# EAGLE board control (EAGLE 8.1.1), part 1 of 2
VERSION: v2.1
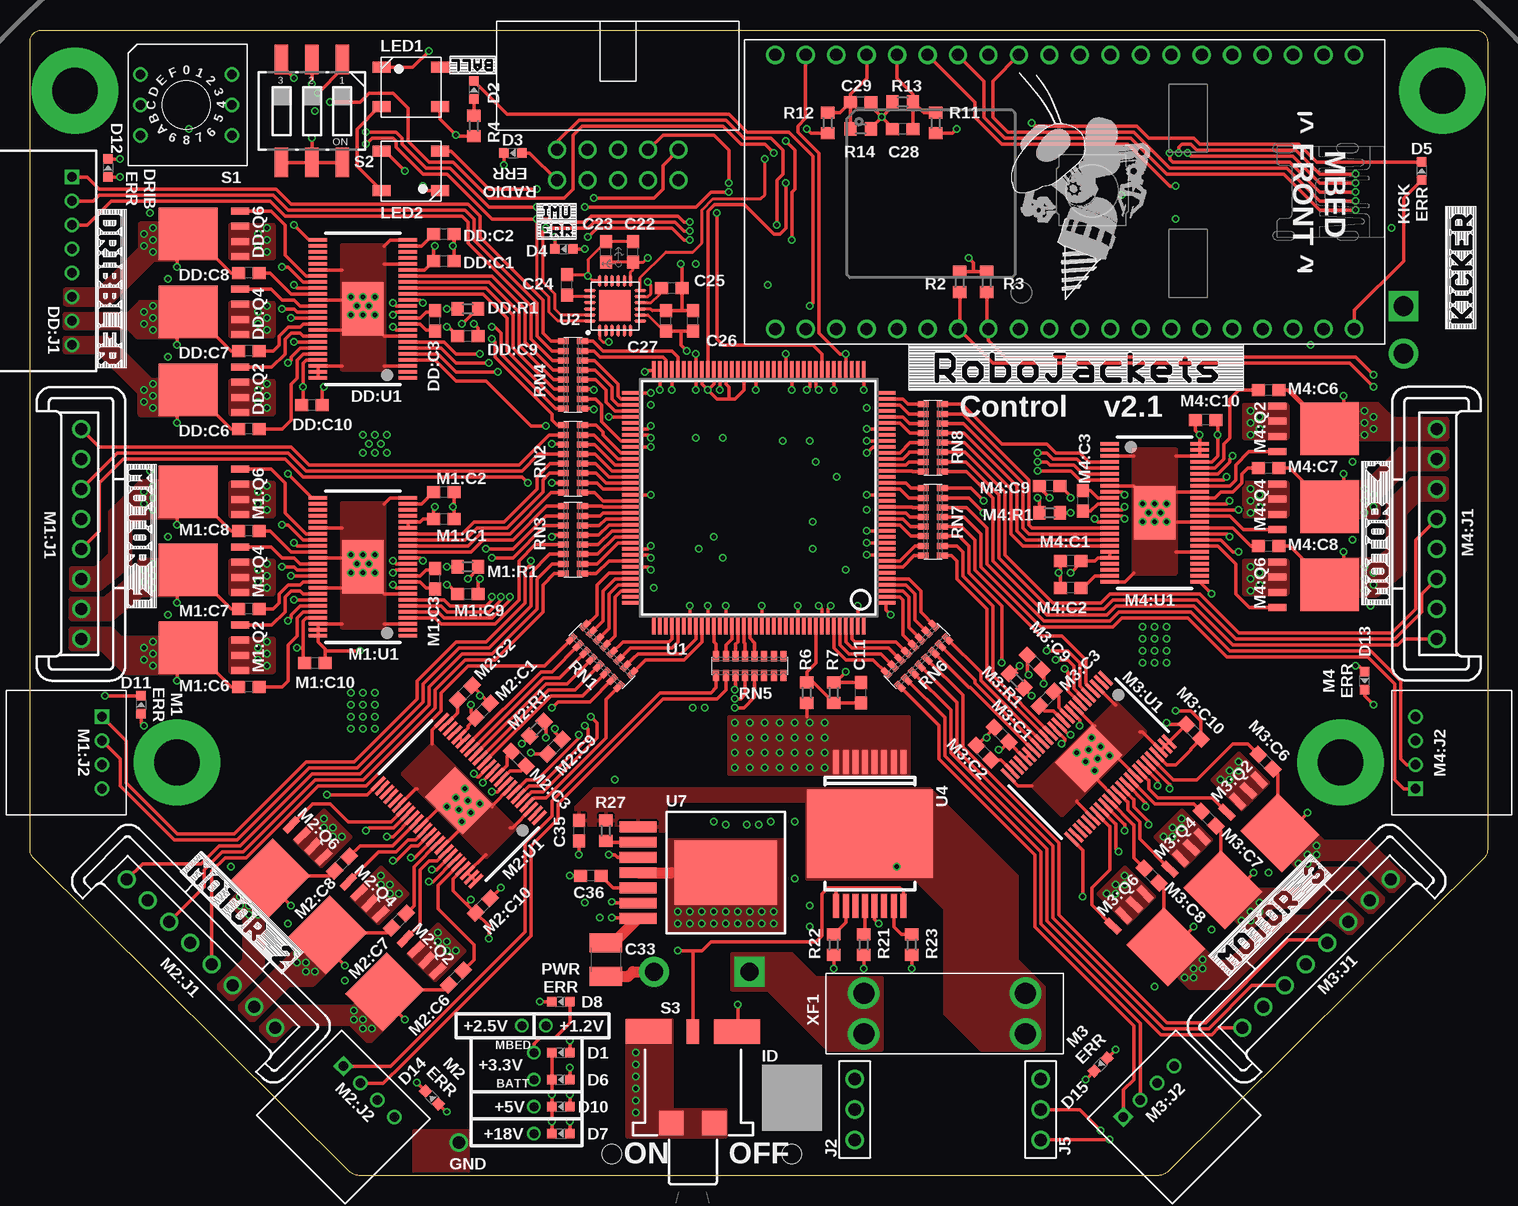
[diagram p7: board, top side]
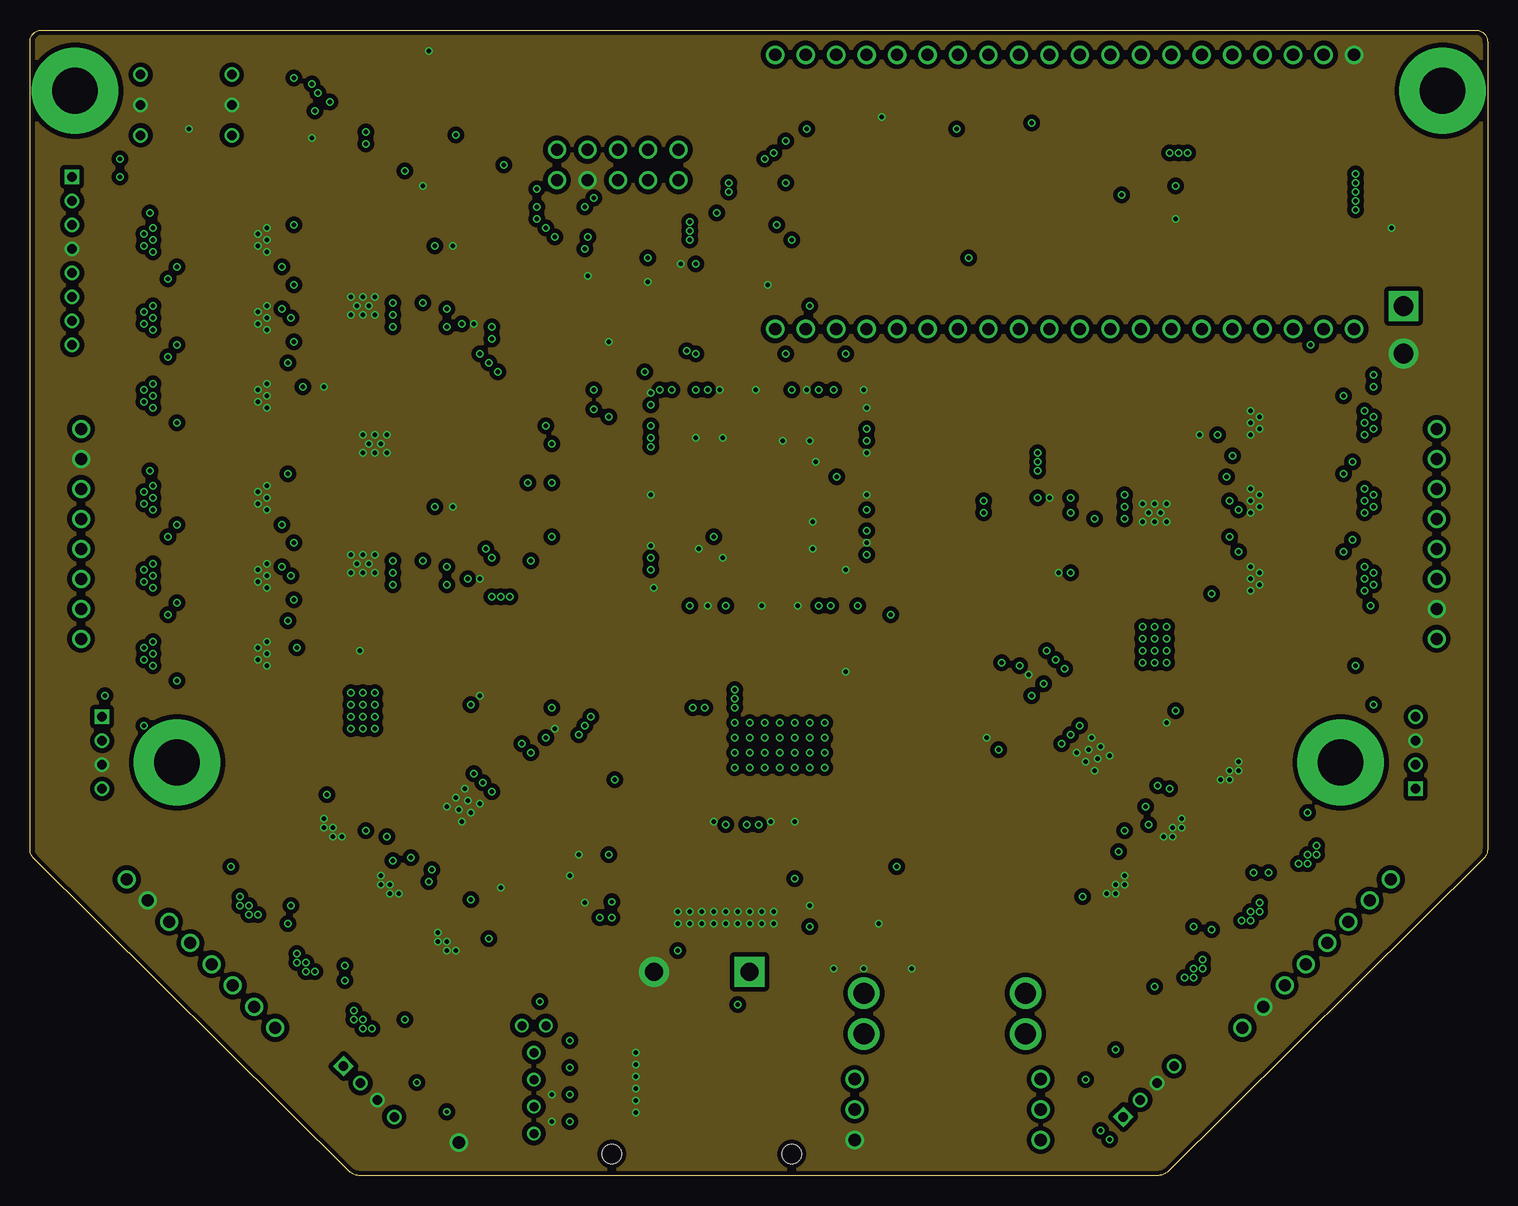
[diagram p8: board, inner layer GND]
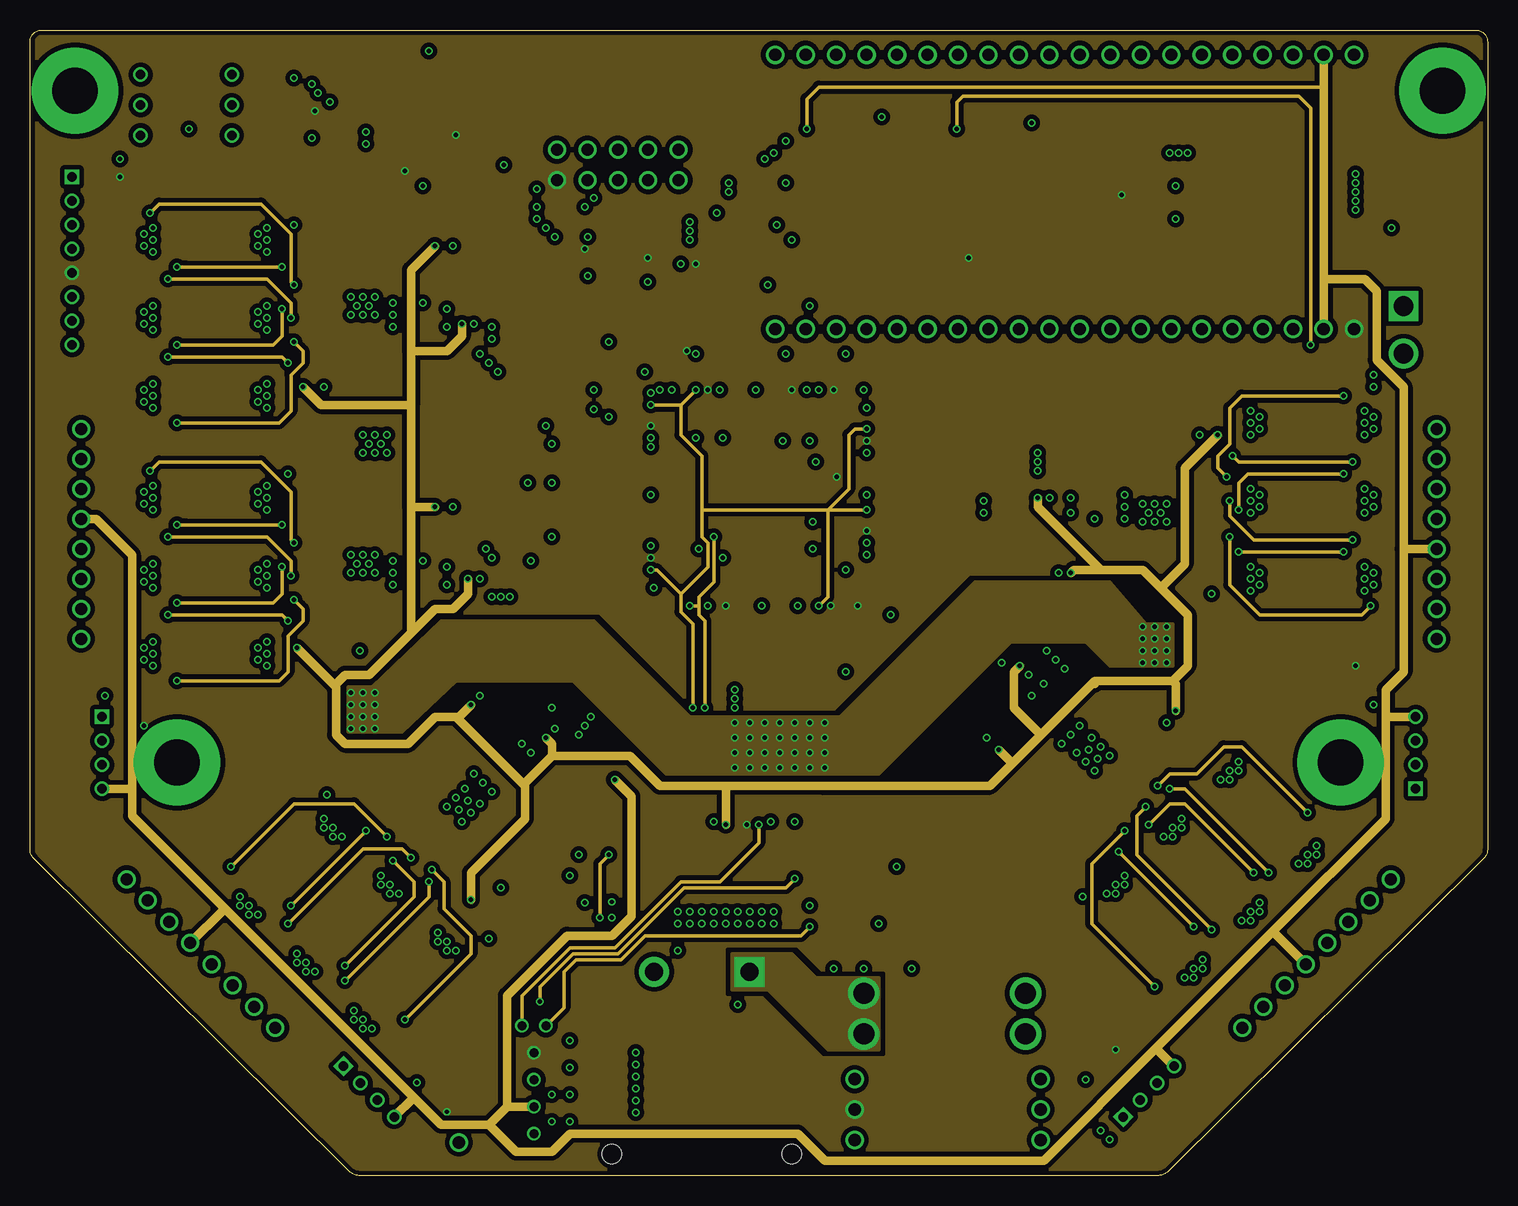
[diagram p9: board, inner layer Power]
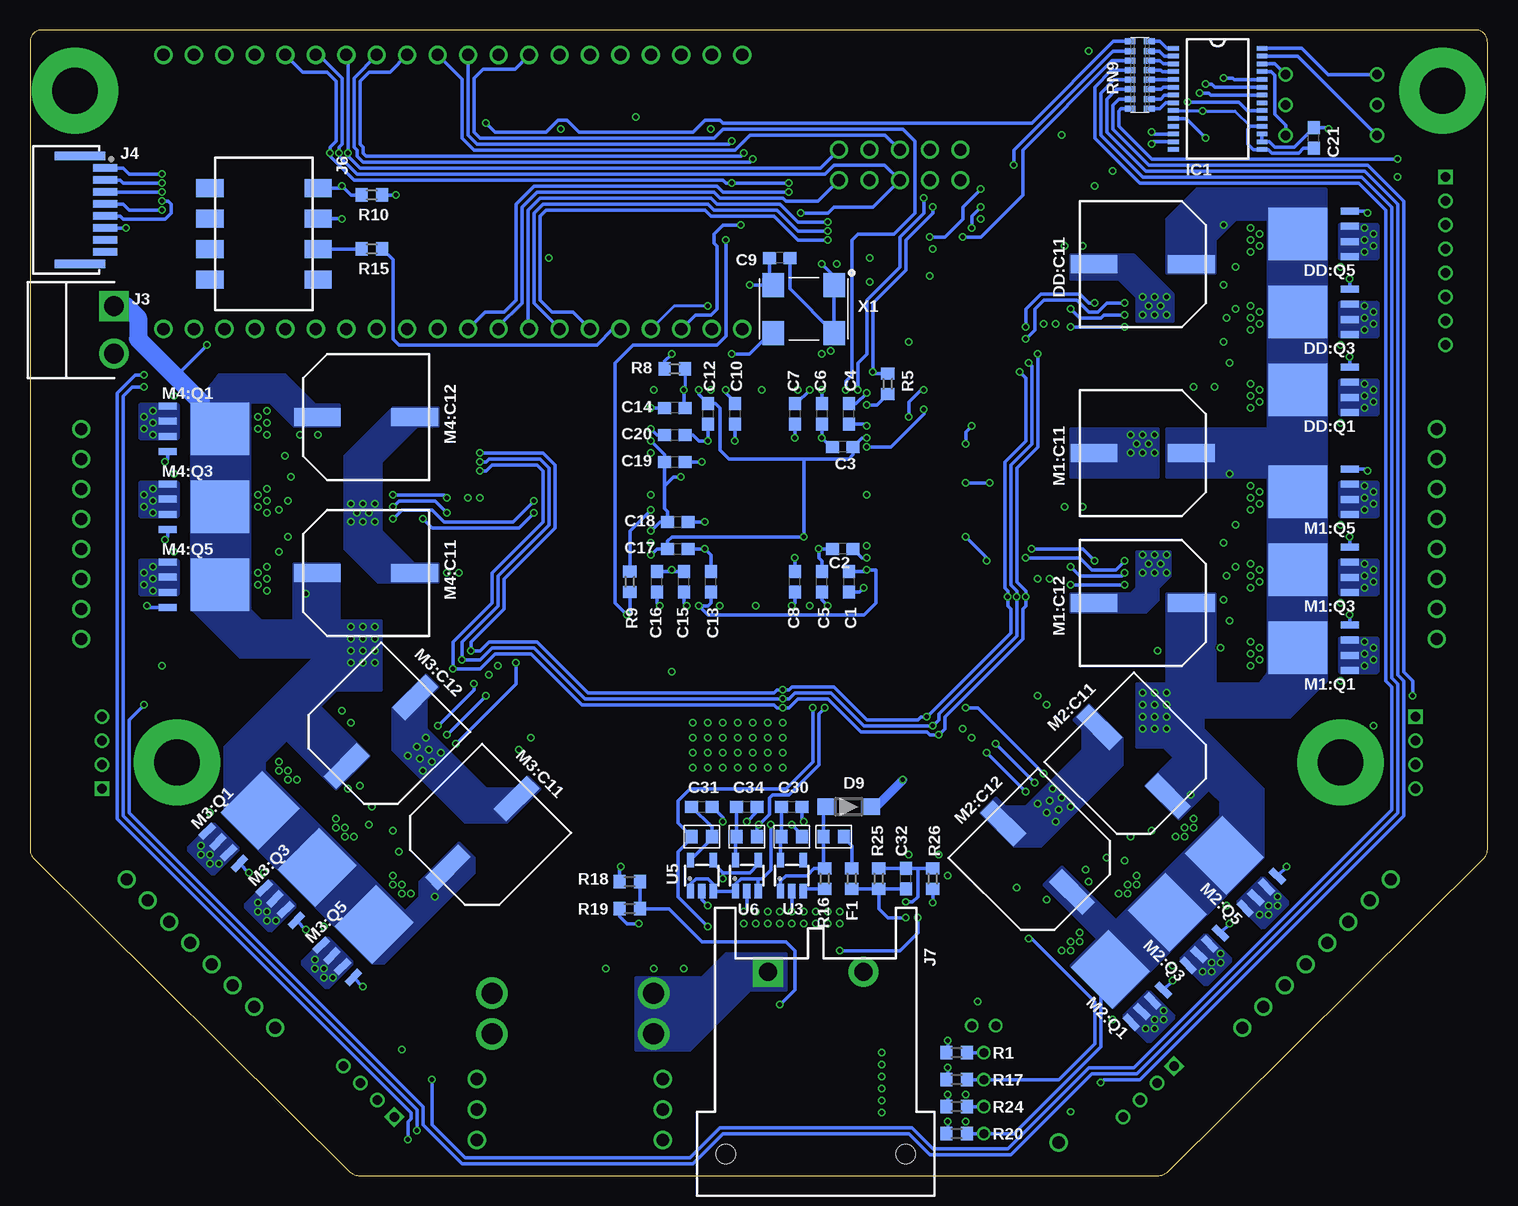
[diagram p10: board, bottom side, seen from below]

Size 121.5 x 95.5 mm. Coordinates in mm from the lower left corner, seen from the top.
Outline: 121.2,26.46 94.79,0.29 arc-45 94.09,0 27.41,0 arc-45 26.71,0.29 0.3,26.46 arc-45 0,27.17 0,94.5 arc-90 1,95.5 120.5,95.5 arc-90 121.5,94.5 121.5,27.17 arc-45 121.2,26.46
Copper layers (1+2*3+16): Top 0.018mm / dielectric 0.36mm / GND 0.035mm / dielectric 0.71mm / Power 0.035mm / dielectric 0.36mm / Bottom 0.018mm
Design rules "eC_4Layer_PClass6_BaseCopperO18-I35_eCDefault *": minimum track width 0.15mm, minimum drill 0.35mm, track to track 0.15mm, track to pad 0.15mm, pad to pad 0.15mm, via to via 0.15mm, smd to smd 0mil, copper to edge 0.25mm, drill to drill 0.35mm, minimum pad ring 0.175mm, minimum via ring 0.125mm, stop-mask expansion 0mil, vias tented up to drill 0.45mm, thermal gap 0.2mm

## Footprints (pad centres in the part's own frame; a part is rotated, then mirrored left to right if it is on the bottom)
C0603 = smd 1.1 x 1: 1 -0.85,0; 2 0.85,0
C1210 = smd 1.6 x 2.7: 1 -1.4,0; 2 1.4,0
CHIP-LED0603 = smd 0.8 x 0.8: A 0,-0.75; C 0,0.75
SOD123 = smd 1.4 x 1.4: A 1.9,0; C -1.9,0
UWZ1H221MCL1GS = smd 1.5 x 3.9: 1 0,4.05; 2 0,-4.05
2MM-8-H = drill 0.8 square: 1 -7,0 | drill 0.8: 2 -5,0; 3 -3,0; 4 -1,0; 5 1,0; 6 3,0; 7 5,0; 8 7,0
PQFN_5X6_E = smd 1.5 x 0.6: 1 -3.02,1.905; 2 -3.02,0.635; 3 -3.02,-0.635; 4 -3.02,-1.905 | smd 4.895 x 4.41: 5678 1.323,0
R0603 = smd 1 x 1.1: 1 -0.85,0; 2 0.85,0
TSSOP-48_PAD = smd 0.3 x 1.55: 1 -5.75,-3.75; 2 -5.25,-3.75; 3 -4.75,-3.75; 4 -4.25,-3.75; 5 -3.75,-3.75; 6 -3.25,-3.75; 7 -2.75,-3.75; 8 -2.25,-3.75; 9 -1.75,-3.75; 10 -1.25,-3.75; 11 -0.75,-3.75; 12 -0.25,-3.75; 13 0.25,-3.75; 14 0.75,-3.75; 15 1.25,-3.75; 16 1.75,-3.75; 17 2.25,-3.75; 18 2.75,-3.75; 19 3.25,-3.75; 20 3.75,-3.75; 21 4.25,-3.75; 22 4.75,-3.75; 23 5.25,-3.75; 24 5.75,-3.75; 25 5.75,3.75; 26 5.25,3.75; 27 4.75,3.75; 28 4.25,3.75; 29 3.75,3.75; 30 3.25,3.75; 31 2.75,3.75; 32 2.25,3.75; 33 1.75,3.75; 34 1.25,3.75; 35 0.75,3.75; 36 0.25,3.75; 37 -0.25,3.75; 38 -0.75,3.75; 39 -1.25,3.75; 40 -1.75,3.75; 41 -2.25,3.75; 42 -2.75,3.75; 43 -3.25,3.75; 44 -3.75,3.75; 45 -4.25,3.75; 46 -4.75,3.75; 47 -5.25,3.75; 48 -5.75,3.75 | smd 4.42 x 3.483: PAD 0,0
F0603 = smd 1 x 1.1: 1 -0.85,0; 2 0.85,0
SSOP-28 = smd 0.9 x 0.38: 1 -3.7,4.225; 2 -3.7,3.575; 3 -3.7,2.925; 4 -3.7,2.275; 5 -3.7,1.625; 6 -3.7,0.975; 7 -3.7,0.325; 8 -3.7,-0.325; 9 -3.7,-0.975; 10 -3.7,-1.625; 11 -3.7,-2.275; 12 -3.7,-2.925; 13 -3.7,-3.575; 14 -3.7,-4.225; 15 3.7,-4.225; 16 3.7,-3.575; 17 3.7,-2.925; 18 3.7,-2.275; 19 3.7,-1.625; 20 3.7,-0.975; 21 3.7,-0.325; 22 3.7,0.325; 23 3.7,0.975; 24 3.7,1.625; 25 3.7,2.275; 26 3.7,2.925; 27 3.7,3.575; 28 3.7,4.225
SBH11-*-D05-RA = drill 1: 1 -5.08,-1.27; 2 -2.54,-1.27; 3 0,-1.27; 4 2.54,-1.27; 5 5.08,-1.27; 6 5.08,1.27; 7 2.54,1.27; 8 0,1.27; 9 -2.54,1.27; 10 -5.08,1.27
3-PIN-HEADER = drill 1.02: 1 -2.54,0; 2 0,0; 3 2.54,0
B2PS-CENTERED = drill 1.65 square: 1 -1.98,0 | drill 1.65: 2 1.98,0
HFW8R-1ST = smd 0.6 x 2: 1 -3.5,3.25; 2 -2.5,3.25; 3 -1.5,3.25; 4 -0.5,3.25; 5 0.5,3.25; 6 1.5,3.25; 7 2.5,3.25; 8 3.5,3.25 | smd 0.7 x 4.2: LEG1 -4.5,1.15; LEG2 4.5,1.15
147721-3 = smd 1.52 x 2.29: 1 -3.81,4.52; 2 -1.27,4.52; 3 1.27,4.52; 4 3.81,4.52; 5 3.81,-4.52; 6 1.27,-4.52; 7 -1.27,-4.52; 8 -3.81,-4.52
DF22-2-H = drill 1.5 pad 2.5 square: 1 3.96,0 | drill 1.5 pad 2.5: 2 -3.96,0 | hole 1.6: -7.5,15.2; 7.5,15.2
MBED-KIT = drill 1.02: D+ 11.43,1.27; D- 11.43,3.81; GND -11.43,24.13; IF+ 11.43,16.51; IF- 11.43,19.05; NR -11.43,16.51; P$5 -11.43,13.97; P$6 -11.43,11.43; P$7 -11.43,8.89; P$8 -11.43,6.35; P$9 -11.43,3.81; P$10 -11.43,1.27; P$11 -11.43,-1.27; P$12 -11.43,-3.81; P$13 -11.43,-6.35; P$14 -11.43,-8.89; P$15 -11.43,-11.43; P$16 -11.43,-13.97; P$17 -11.43,-16.51; P$18 -11.43,-19.05; P$19 -11.43,-21.59; P$20 -11.43,-24.13; P$21 11.43,-24.13; P$22 11.43,-21.59; P$23 11.43,-19.05; P$24 11.43,-16.51; P$25 11.43,-13.97; P$26 11.43,-11.43; P$27 11.43,-8.89; P$28 11.43,-6.35; P$29 11.43,-3.81; P$30 11.43,-1.27; RD+ 11.43,11.43; RD- 11.43,13.97; TD+ 11.43,6.35; TD- 11.43,8.89; VB -11.43,19.05; VIN -11.43,21.59; VOUT 11.43,24.13; VU 11.43,21.59
5050 = smd 1.5 x 0.9: 1 -2.45,1.65; 2 -2.45,-1.65; 3 2.45,-1.65; 4 2.45,1.65
MKS-1658 = drill 1 pad 1.422: 1 -8.75,0; 2 -6.25,0; 3 -3.75,0; 4 -1.25,0; 5 1.25,0; 6 3.75,0; 7 6.25,0; 8 8.75,0
2MM-4-H = drill 0.8 square: 1 -3,0 | drill 0.8: 2 -1,0; 3 1,0; 4 3,0
RA-8_2506 = smd 0.5 x 0.9: 1 -2.8,-0.8; 2 -2,-0.8; 3 -1.2,-0.8; 4 -0.4,-0.8; 5 0.4,-0.8; 6 1.2,-0.8; 7 2,-0.8; 8 2.8,-0.8; 9 2.8,0.8; 10 2,0.8; 11 1.2,0.8; 12 0.4,0.8; 13 -0.4,0.8; 14 -1.2,0.8; 15 -2,0.8; 16 -2.8,0.8
HEX = drill 0.8: 1 -2.54,-2.54; 2 2.54,5.08; 4 2.54,-2.54; 8 -2.54,5.08; C1 0,-2.54; C2 0,5.08
CTS-219-03 = smd 1.13 x 2.44: 1 -2.54,-4.3; 2 0,-4.3; 3 2.54,-4.3; 4 2.54,4.3; 5 0,4.3; 6 -2.54,4.3
34EWMSP12M6RT = smd 3.81 x 2.03: 1 -3.685,0; 3 3.685,0 | smd 1.02 x 2.03: 2 0,0 | smd 2.03 x 2.03: LEG1 -1.78,7.62; LEG3 1.78,7.62
SB0603 = smd 1 x 1.1: 1 -0.85,0; 2 0.85,0
TQFP144 = smd 0.3 x 1.6: 1 -8.75,-10.6; 2 -8.25,-10.6; 3 -7.75,-10.6; 4 -7.25,-10.6; 5 -6.75,-10.6; 6 -6.25,-10.6; 7 -5.75,-10.6; 8 -5.25,-10.6; 9 -4.75,-10.6; 10 -4.25,-10.6; 11 -3.75,-10.6; 12 -3.25,-10.6; 13 -2.75,-10.6; 14 -2.25,-10.6; 15 -1.75,-10.6; 16 -1.25,-10.6; 17 -0.75,-10.6; 18 -0.25,-10.6; 19 0.25,-10.6; 20 0.75,-10.6; 21 1.25,-10.6; 22 1.75,-10.6; 23 2.25,-10.6; 24 2.75,-10.6; 25 3.25,-10.6; 26 3.75,-10.6; 27 4.25,-10.6; 28 4.75,-10.6; 29 5.25,-10.6; 30 5.75,-10.6; 31 6.25,-10.6; 32 6.75,-10.6; 33 7.25,-10.6; 34 7.75,-10.6; 35 8.25,-10.6; 36 8.75,-10.6; 73 8.75,10.6; 74 8.25,10.6; 75 7.75,10.6; 76 7.25,10.6; 77 6.75,10.6; 78 6.25,10.6; 79 5.75,10.6; 80 5.25,10.6; 81 4.75,10.6; 82 4.25,10.6; 83 3.75,10.6; 84 3.25,10.6; 85 2.75,10.6; 86 2.25,10.6; 87 1.75,10.6; 88 1.25,10.6; 89 0.75,10.6; 90 0.25,10.6; 91 -0.25,10.6; 92 -0.75,10.6; 93 -1.25,10.6; 94 -1.75,10.6; 95 -2.25,10.6; 96 -2.75,10.6; 97 -3.25,10.6; 98 -3.75,10.6; 99 -4.25,10.6; 100 -4.75,10.6; 101 -5.25,10.6; 102 -5.75,10.6; 103 -6.25,10.6; 104 -6.75,10.6; 105 -7.25,10.6; 106 -7.75,10.6; 107 -8.25,10.6; 108 -8.75,10.6 | smd 1.6 x 0.3: 37 10.6,-8.75; 38 10.6,-8.25; 39 10.6,-7.75; 40 10.6,-7.25; 41 10.6,-6.75; 42 10.6,-6.25; 43 10.6,-5.75; 44 10.6,-5.25; 45 10.6,-4.75; 46 10.6,-4.25; 47 10.6,-3.75; 48 10.6,-3.25; 49 10.6,-2.75; 50 10.6,-2.25; 51 10.6,-1.75; 52 10.6,-1.25; 53 10.6,-0.75; 54 10.6,-0.25; 55 10.6,0.25; 56 10.6,0.75; 57 10.6,1.25; 58 10.6,1.75; 59 10.6,2.25; 60 10.6,2.75; 61 10.6,3.25; 62 10.6,3.75; 63 10.6,4.25; 64 10.6,4.75; 65 10.6,5.25; 66 10.6,5.75; 67 10.6,6.25; 68 10.6,6.75; 69 10.6,7.25; 70 10.6,7.75; 71 10.6,8.25; 72 10.6,8.75; 109 -10.6,8.75; 110 -10.6,8.25; 111 -10.6,7.75; 112 -10.6,7.25; 113 -10.6,6.75; 114 -10.6,6.25; 115 -10.6,5.75; 116 -10.6,5.25; 117 -10.6,4.75; 118 -10.6,4.25; 119 -10.6,3.75; 120 -10.6,3.25; 121 -10.6,2.75; 122 -10.6,2.25; 123 -10.6,1.75; 124 -10.6,1.25; 125 -10.6,0.75; 126 -10.6,0.25; 127 -10.6,-0.25; 128 -10.6,-0.75; 129 -10.6,-1.25; 130 -10.6,-1.75; 131 -10.6,-2.25; 132 -10.6,-2.75; 133 -10.6,-3.25; 134 -10.6,-3.75; 135 -10.6,-4.25; 136 -10.6,-4.75; 137 -10.6,-5.25; 138 -10.6,-5.75; 139 -10.6,-6.25; 140 -10.6,-6.75; 141 -10.6,-7.25; 142 -10.6,-7.75; 143 -10.6,-8.25; 144 -10.6,-8.75
QFN-24-4MM2 = smd 1.016 x 0.254: 1 -2.066,1.257; 2 -2.066,0.75; 3 -2.066,0.247; 4 -2.066,-0.287; 5 -2.066,-0.792; 6 -2.066,-1.297; 13 2.086,-1.297; 14 2.086,-0.792; 15 2.086,-0.287; 16 2.086,0.247; 17 2.086,0.75; 18 2.086,1.257 | smd 0.254 x 1.016: 7 -1.267,-2.122; 8 -0.762,-2.122; 9 -0.258,-2.122; 10 0.278,-2.122; 11 0.78,-2.122; 12 1.287,-2.122; 19 1.287,2.082; 20 0.78,2.082; 21 0.278,2.082; 22 -0.258,2.082; 23 -0.762,2.082; 24 -1.267,2.082 | smd 2.616 x 2.616: P$1 0.02,-0.01
SOT-23-5 = smd 0.6 x 1.2: 1 -0.95,-1.306; 2 0,-1.306; 3 0.95,-1.306; 4 0.95,1.306; 5 -0.95,1.306
POWERSO-16 = smd 0.5 x 2: 1 -2.8,-6; 2 -2,-6; 3 -1.2,-6; 4 -0.4,-6; 5 0.4,-6; 6 1.2,-6; 7 2,-6; 8 2.8,-6; 9 2.8,6; 10 2,6; 11 1.2,6; 12 0.4,6; 13 -0.4,6; 14 -1.2,6; 15 -2,6; 16 -2.8,6 | smd 10.5 x 7.4: 17 0,0
TO-PMOD-7 = smd 0.89 x 3.06: 1 -3.81,-7.305; 2 -2.54,-7.305; 3 -1.27,-7.305; 4 0,-7.305; 5 1.27,-7.305; 6 2.54,-7.305; 7 3.81,-7.305 | smd 5.35 x 8.54: PAD 0,0
ASV = smd 1.8 x 2: 1 -2.54,-2; 2 2.54,-2; 3 2.54,2; 4 -2.54,2
3557-2 = drill 1.75: 1 -6.735,1.7; 2 -6.735,-1.7; 3 6.735,-1.7; 4 6.735,1.7

## Placement (x,y rotation side)
C1  0.1uF  [C0603]  53.25,49.5 270 bottom
C2  0.1uF  [C0603]  53.75,52.25 180 bottom
C3  0.1uF  [C0603]  53.75,60.75 180 bottom
C4  0.1uF  [C0603]  53.25,63.5 90 bottom
C5  0.1uF  [C0603]  55.5,49.5 90 bottom
C6  0.1uF  [C0603]  55.5,63.5 270 bottom
C7  0.1uF  [C0603]  57.75,63.5 270 bottom
C8  0.1uF  [C0603]  57.75,49.5 90 bottom
C9  0.1uF  [C0603]  59,76.5 180 bottom
C10  0.1uF  [C0603]  62.75,63.5 270 bottom
C11  0.1uF  [C0603]  69.25,40.25 90 top
C12  0.1uF  [C0603]  65,63.5 270 bottom
C13  0.1uF  [C0603]  64.75,49.5 90 bottom
C14  0.1uF  [C0603]  67.75,64 180 bottom
C15  0.1uF  [C0603]  67,49.5 90 bottom
C16  0.1uF  [C0603]  69.25,49.5 90 bottom
C17  0.1uF  [C0603]  67.5,52.25 0 bottom
C18  0.1uF  [C0603]  67.5,54.5 0 bottom
C19  0.1uF  [C0603]  67.75,59.5 0 bottom
C20  0.1uF  [C0603]  67.75,61.75 0 bottom
C21  0.1uF  [C0603]  14.5,86.5 90 bottom
C22  0.47uF  [C0603]  50.25,77 90 top
C23  0.47uF  [C0603]  48,77 90 top
C24  2200pF  [C0603]  44.75,74.25 90 top
C25  0.1uF  [C0603]  53.5,74 0 top
C26  10000pF  [C0603]  55.25,71.25 90 top
C27  0.47uF  [C0603]  53,71.25 90 top
C28  0.1uF  [C0603]  72.75,87.25 180 top
C29  0.1uF  [C0603]  69.25,89.5 0 top
C30  1uF  [C0603]  58,30.75 0 bottom
C31  1uF  [C0603]  65.5,30.75 0 bottom
C32  0.022uF  [C0603]  48.5,24.75 90 bottom
C33  LMK325ABJ107MM-P  [C1210]  48,18 270 top
C34  1uF  [C0603]  61.75,30.75 0 bottom
C35  GRM188R6YA106MA73D  [C0603]  45.75,28.75 270 top
C36  0.1uF 50V  [C0603]  46.75,25 180 top
D1  GREEN  [CHIP-LED0603]  44.25,10.25 90 top
D2  BLUE  [CHIP-LED0603]  37,90.5 0 top
D3  RED  [CHIP-LED0603]  40.25,85.25 90 top
D4  RED  [CHIP-LED0603]  44.5,77.25 90 top
D5  RED  [CHIP-LED0603]  116,83.75 0 top
D6  GREEN  [CHIP-LED0603]  44.25,8 90 top
D7  GREEN  [CHIP-LED0603]  44.25,3.5 90 top
D8  RED  [CHIP-LED0603]  44.25,14.5 90 top
D9  [SOD123]  53.25,30.75 180 bottom
D10  GREEN  [CHIP-LED0603]  44.25,5.75 90 top
D11  RED  [CHIP-LED0603]  9.25,39.25 0 top
D12  RED  [CHIP-LED0603]  6.5,84 0 top
D13  RED  [CHIP-LED0603]  111.25,41.25 180 top
D14  RED  [CHIP-LED0603]  33.5,6.5 45 top
D15  RED  [CHIP-LED0603]  89.25,9.25 135 top
DD:C1  1uF  [C0603]  34.5,76.25 0 top
DD:C2  1uF  [C0603]  34.5,78.5 0 top
DD:C3  0.022uF 50V  [C0603]  33.75,71.25 90 top
DD:C6  0.1uF 50V  [C0603]  18.25,62.25 180 top
DD:C7  0.1uF 50V  [C0603]  18.25,68.75 180 top
DD:C8  0.1uF 50V  [C0603]  18.25,75.25 180 top
DD:C9  2.2uF 50V  [C0603]  36.5,70 0 top
DD:C10  0.1uF 50V  [C0603]  23.5,64.25 0 top
DD:C11  UWZ1H221MCL1GS  [UWZ1H221MCL1GS]  28.75,76 270 bottom
DD:J1  8-PIN_2MM-H  [2MM-8-H]  3.5,76.25 270 top
DD:Q1  IRFH7545  [PQFN_5X6_E]  14.5,65.5 180 bottom
DD:Q2  IRFH7545  [PQFN_5X6_E]  14.5,65.5 180 top
DD:Q3  IRFH7545  [PQFN_5X6_E]  14.5,72 180 bottom
DD:Q4  IRFH7545  [PQFN_5X6_E]  14.5,72 180 top
DD:Q5  IRFH7545  [PQFN_5X6_E]  14.5,78.5 180 bottom
DD:Q6  IRFH7545  [PQFN_5X6_E]  14.5,78.5 180 top
DD:R1  10k  [R0603]  36.5,72.25 180 top
DD:U1  DRV8303DCA  [TSSOP-48_PAD]  27.75,72.25 90 top
F1  0603L075SLYR  [F0603]  53,24.75 90 bottom
IC1  MCP23017-E/SS  [SSOP-28]  22.5,89.75 0 bottom
J1  SBH11-PBPC-D05-RA  [SBH11-*-D05-RA]  49,84.25 180 top
J2  3-PIN-HEADER  [3-PIN-HEADER]  68.75,5.5 90 top
J3  B2PS-VH(LF)(SN)  [B2PS-CENTERED]  114.5,70.5 270 bottom
J4  HFW8R-1ST  [HFW8R-1ST]  118.5,80.5 270 bottom
J5  3-PIN-HEADER  [3-PIN-HEADER]  84.25,5.5 90 top
J6  147721-3  [147721-3]  102,78.5 270 bottom
J7  DF22-2  [DF22-2-H]  56,17 180 bottom
KIT1  MBED_NXP_LPC1768  [MBED-KIT]  86.25,82 270 top
LED1  WS2812B  [5050]  31.75,90.75 180 top
LED2  WS2812B  [5050]  31.75,83.75 0 top
M1:C1  1uF  [C0603]  34.5,54.75 0 top
M1:C2  1uF  [C0603]  34.5,57 0 top
M1:C3  0.022uF 50V  [C0603]  33.75,49.75 90 top
M1:C6  0.1uF 50V  [C0603]  18.25,40.75 180 top
M1:C7  0.1uF 50V  [C0603]  18.25,47.25 180 top
M1:C8  0.1uF 50V  [C0603]  18.25,53.75 180 top
M1:C9  2.2uF 50V  [C0603]  36.5,48.5 0 top
M1:C10  0.1uF 50V  [C0603]  23.75,42.75 0 top
M1:C11  UWZ1H221MCL1GS  [UWZ1H221MCL1GS]  28.75,60.25 270 bottom
M1:C12  UWZ1H221MCL1GS  [UWZ1H221MCL1GS]  28.75,47.75 270 bottom
M1:J1  MKS-1658  [MKS-1658]  4.25,53.5 270 top
M1:J2  4-PIN_2MM-H  [2MM-4-H]  6,35.25 270 top
M1:Q1  IRFH7545  [PQFN_5X6_E]  14.5,44 180 bottom
M1:Q2  IRFH7545  [PQFN_5X6_E]  14.5,44 180 top
M1:Q3  IRFH7545  [PQFN_5X6_E]  14.5,50.5 180 bottom
M1:Q4  IRFH7545  [PQFN_5X6_E]  14.5,50.5 180 top
M1:Q5  IRFH7545  [PQFN_5X6_E]  14.5,57 180 bottom
M1:Q6  IRFH7545  [PQFN_5X6_E]  14.5,57 180 top
M1:R1  10k  [R0603]  36.5,50.75 180 top
M1:U1  DRV8303DCA  [TSSOP-48_PAD]  27.75,50.75 90 top
M2:C1  1uF  [C0603]  37.75,38.75 45 top
M2:C2  1uF  [C0603]  36.25,40.25 45 top
M2:C3  0.022uF 50V  [C0603]  40.75,34.75 135 top
M2:C6  0.1uF 50V  [C0603]  35.5,16.5 225 top
M2:C7  0.1uF 50V  [C0603]  30.75,21.25 225 top
M2:C8  0.1uF 50V  [C0603]  26,26 225 top
M2:C9  2.2uF 50V  [C0603]  43.75,35.75 45 top
M2:C10  0.1uF 50V  [C0603]  37.75,22.5 45 top
M2:C11  UWZ1H221MCL1GS  [UWZ1H221MCL1GS]  29.5,34.5 225 bottom
M2:C12  UWZ1H221MCL1GS  [UWZ1H221MCL1GS]  37.5,26.5 225 bottom
M2:J1  MKS-1658  [MKS-1658]  14.25,18.5 315 top
M2:J2  4-PIN_2MM-H  [2MM-4-H]  28.25,7 315 top
M2:Q1  IRFH7545  [PQFN_5X6_E]  30.5,16.25 135 bottom
M2:Q2  IRFH7545  [PQFN_5X6_E]  30.5,16.25 225 top
M2:Q3  IRFH7545  [PQFN_5X6_E]  25.75,21 135 bottom
M2:Q4  IRFH7545  [PQFN_5X6_E]  25.75,21 225 top
M2:Q5  IRFH7545  [PQFN_5X6_E]  21,25.75 135 bottom
M2:Q6  IRFH7545  [PQFN_5X6_E]  21,25.75 225 top
M2:R1  10k  [R0603]  42.25,37.25 225 top
M2:U1  DRV8303DCA  [TSSOP-48_PAD]  35.75,31.25 135 top
M3:C1  1uF  [C0603]  81,36.75 135 top
M3:C2  1uF  [C0603]  79.5,35.25 135 top
M3:C3  0.022uF 50V  [C0603]  84.75,39.75 225 top
M3:C6  0.1uF 50V  [C0603]  103,34.5 315 top
M3:C7  0.1uF 50V  [C0603]  98.25,29.75 315 top
M3:C8  0.1uF 50V  [C0603]  93.5,25 315 top
M3:C9  2.2uF 50V  [C0603]  83.75,42.75 135 top
M3:C10  0.1uF 50V  [C0603]  97,37 135 top
M3:C11  UWZ1H221MCL1GS  [UWZ1H221MCL1GS]  83.81,28.56 135 bottom
M3:C12  UWZ1H221MCL1GS  [UWZ1H221MCL1GS]  92.25,37 135 bottom
M3:J1  MKS-1658  [MKS-1658]  107.25,18.5 45 top
M3:J2  4-PIN_2MM-H  [2MM-4-H]  93.25,7 45 top
M3:Q1  IRFH7545  [PQFN_5X6_E]  103.25,29.5 45 bottom
M3:Q2  IRFH7545  [PQFN_5X6_E]  103.25,29.5 315 top
M3:Q3  IRFH7545  [PQFN_5X6_E]  98.5,24.75 45 bottom
M3:Q4  IRFH7545  [PQFN_5X6_E]  98.5,24.75 315 top
M3:Q5  IRFH7545  [PQFN_5X6_E]  93.75,20 45 bottom
M3:Q6  IRFH7545  [PQFN_5X6_E]  93.75,20 315 top
M3:R1  10k  [R0603]  82.25,41.25 315 top
M3:U1  DRV8303DCA  [TSSOP-48_PAD]  88.25,34.75 225 top
M4:C1  1uF  [C0603]  86.75,51.25 180 top
M4:C2  1uF  [C0603]  86.75,49 180 top
M4:C3  0.022uF 50V  [C0603]  87.75,56.25 270 top
M4:C6  0.1uF 50V  [C0603]  103.25,65.5 0 top
M4:C7  0.1uF 50V  [C0603]  103.25,59 0 top
M4:C8  0.1uF 50V  [C0603]  103.25,52.5 0 top
M4:C9  2.2uF 50V  [C0603]  85,57.5 180 top
M4:C10  0.1uF 50V  [C0603]  98,63 180 top
M4:C11  UWZ1H221MCL1GS  [UWZ1H221MCL1GS]  93.5,50.25 90 bottom
M4:C12  UWZ1H221MCL1GS  [UWZ1H221MCL1GS]  93.5,63.25 90 bottom
M4:J1  MKS-1658  [MKS-1658]  117.25,53.5 90 top
M4:J2  4-PIN_2MM-H  [2MM-4-H]  115.5,35.25 90 top
M4:Q1  IRFH7545  [PQFN_5X6_E]  107,62.25 0 bottom
M4:Q2  IRFH7545  [PQFN_5X6_E]  107,62.25 0 top
M4:Q3  IRFH7545  [PQFN_5X6_E]  107,55.75 0 bottom
M4:Q4  IRFH7545  [PQFN_5X6_E]  107,55.75 0 top
M4:Q5  IRFH7545  [PQFN_5X6_E]  107,49.25 0 bottom
M4:Q6  IRFH7545  [PQFN_5X6_E]  107,49.25 0 top
M4:R1  10k  [R0603]  85,55.25 0 top
M4:U1  DRV8303DCA  [TSSOP-48_PAD]  93.75,55.25 270 top
R1  330  [R0603]  44.25,10.25 180 bottom
R2  4.7k  [R0603]  77.5,74.5 90 top
R3  4.7k  [R0603]  79.75,74.5 90 top
R4  330  [R0603]  37,87.5 270 top
R5  330  [R0603]  50,66 270 bottom
R6  68k  [R0603]  64.75,40.25 90 top
R7  10k  [R0603]  67,40.25 90 top
R8  4.7k  [R0603]  67.75,67.25 180 bottom
R9  4.7k  [R0603]  71.5,49.5 90 bottom
R10  10k  [R0603]  93,81.75 0 bottom
R11  68k  [R0603]  75.5,87.75 90 top
R12  10k  [R0603]  66.5,87.75 90 top
R13  10k  [R0603]  72.75,89.5 180 top
R14  10k  [R0603]  69.25,87.25 0 top
R15  330  [R0603]  93,77.25 0 bottom
R16  10k  [R0603]  55.25,24.75 90 bottom
R17  330  [R0603]  44.25,8 0 bottom
R18  270k  [R0603]  71.5,24.5 180 bottom
R19  100k  [R0603]  71.5,22.25 0 bottom
R20  1k  [R0603]  44.25,3.5 0 bottom
R21  10k  [R0603]  69.5,19.25 90 top
R22  1k  [R0603]  67,19.25 90 top
R23  1k  [R0603]  73.5,19.25 90 top
R24  1k  [R0603]  44.25,5.75 180 bottom
R25  34k  [R0603]  50.75,24.75 270 bottom
R26  6.49k  [R0603]  46.25,24.75 90 bottom
R27  100k  [R0603]  48,28.75 270 top
RN1  330  [RA-8_2506]  47.68,43.32 135 top
RN2  330  [RA-8_2506]  45.25,59.75 90 top
RN3  330  [RA-8_2506]  45.25,53 90 top
RN4  330  [RA-8_2506]  45.25,66.75 90 top
RN5  330  [RA-8_2506]  60,42.5 180 top
RN6  330  [RA-8_2506]  73.93,43.32 225 top
RN7  330  [RA-8_2506]  75.25,54.5 270 top
RN8  330  [RA-8_2506]  75.25,61.5 270 top
RN9  330  [RA-8_2506]  29,91.75 90 bottom
S1  94HCB16T  [HEX]  11.75,89.25 270 top
S2  219-03  [CTS-219-03]  23.5,88.75 180 top
S3  34EWMSP12M6RT  [34EWMSP12M6RT]  55.25,12 180 top
SB1  SOLDERBRIDGESB0603  [SB0603]  58,28.25 0 bottom
SB2  SOLDERBRIDGESB0603  [SB0603]  65.5,28.25 180 bottom
SB3  SOLDERBRIDGESB0603  [SB0603]  54.5,28.25 180 bottom
SB4  SOLDERBRIDGESB0603  [SB0603]  61.75,28.25 0 bottom
U1  XC3S250E-4TQG144C  [TQFP144]  60.75,56.5 90 top
U2  MPU-6050  [QFN-24-4MM2]  48.75,72.5 90 top
U3  TLV70233DBVR  [SOT-23-5]  58,25 0 bottom
U4  VND5E006ASPTR-E  [POWERSO-16]  70,28.5 180 top
U5  MCP1824T-1202E/OT  [SOT-23-5]  65.5,25 0 bottom
U6  MCP1824T-2502E/OT  [SOT-23-5]  61.75,25 0 bottom
U7  LMZ14201  [TO-PMOD-7]  58,25.25 270 top
U$2  [ROBOJACKETS]  73.25,65.46 0 top
U$3  [MOTOR-1]  8,59.31 270 top
U$4  [DRIBBLER]  5.5,80.56 270 top
U$5  [MOTOR-2]  12.5,25.31 315 top
U$6  [MOTOR-3]  100,16.56 45 top
U$7  [MOTOR-4]  113.5,47.56 90 top
U$8  [BALL]  38.75,93.31 180 top
U$9  [KICKER]  120.5,70.56 90 top
U$10  [ERR-IMU]  42.25,78.06 0 top
U$11  [ROBOBUZZ_1.0X2]  86.25,73 0 top
X1  ASV-18.432MHZ-EJ-T  [ASV]  57,72.25 180 bottom
XF1  30A  [3557-2]  76.25,13.5 0 top

## Tracks (layer width: path | path; a pad name or v marks a point on that pad's centre or on a via)
3.3V-EN
  Bottom 0.3: U3.3 56.85,23.9 R16.1
3V3-LED  (via drill 0.35)
  Top 0.3: D6.A v45,9
  Bottom 0.3: v45,9 45,8.1 R17.1
5V-LED  (via drill 0.35)
  Top 0.3: D10.A v45,6.75
  Bottom 0.3: v45,6.75 45,5.85 R24.2
18.5V-LED  (via drill 0.35)
  Top 0.3: D7.A v45,4.5
  Bottom 0.3: v45,4.5 45,3.6 R20.1
!CS!-FPGA  (via drill 0.35)
  Top 0.3: U1.69 v53.5,65.5
  Bottom 0.3: v53.5,65.5 53.5,66.25 53,66.75 53,78 52.5,78.5 49.5,78.5 47.75,80.25 47.75,86.25 48.75,87.25 62.5,87.25 63.75,87.25 64.5,86.5 84,86.5 84.5,87 84.5,91.5 83.75,92.25 81.08,92.25 KIT1.P$13
!CS!-KICK  (via drill 0.35)
  Top 0.3: KIT1.P$14 77.36,93.39 79.5,91.25 79.5,88.25 81.25,86.5 91.75,86.5 93.25,85 93.75,84.5 94.75,83.5 104.5,83.5 107.5,80.5 v110.5,80.5
  Bottom 0.3: v110.5,80.5 113.25,80.5 113.75,81 J4.4
!CS!-RADIO
  Bottom 0.3: KIT1.P$29 82.44,70.81 80.5,72.75 80.5,80.75 79.25,82 64.5,82 63.98,81.48 58.73,81.48 58.5,81.25 55.81,81.25 J1.10
!RST!-KICK  (via drill 0.35)
  Top 0.3: KIT1.P$12 80.25,91.24 80.25,88.25 81.5,87 91,87 92,87 93.75,85.25 94.25,84.75 95,84 104.75,84 107.5,81.25 110,81.25 v110.5,81.25
  Bottom 0.3: J4.5 114,80 113.75,79.75 110.25,79.75 109.75,80.25 109.75,81 110,81.25 v110.5,81.25
!RST!-RADIO  (via drill 0.35)
  Top 0.3: J1.5 43.92,86.17 45.75,88 58,88 59.5,86.5 61.75,86.5 62.75,85.5 62.75,83.5 62.25,83 v62.25,79.25
  Bottom 0.3: KIT1.P$23 66.02,71.75 64.75,71.75 64.25,72.25 64.25,77.5 64.5,77.75 64.5,78.5 63.75,79.25 v62.25,79.25
+1.2V  (via drill 0.35, 0.75)
  Top 0.3: U1.115 v55,47.5 | U1.9 v69.75,51.75 | U1.80 51.5,61.75 v51.75,61.5 | U1.45 65.5,65.75 v65.75,65.5
  Power 0.3: v56.25,39 56.25,46.25 55.75,46.75 55.75,47.5 | v55,47.5 55.75,47.5 | 55.75,47.5 55.75,48.25 57,49.5 v57,53.25 | v65,20.75 64.25,20 51.25,20 49.25,18 45.5,18 44.5,17 44.5,14 v43,12.5
  Bottom 0.3: v69.75,51.75 69.25,52.25 C17.1 68.35,52.9 68,53.25 v57,53.25 57,59.75 | C5.1 55.5,48 v55,47.5 | v51.75,61.5 52.15,61.5 C3.1 52.9,60.1 53.25,59.75 56.75,59.75 57,59.75 | v65.75,65.5 65.75,65.1 C12.1 64.35,64.35 64,64 64,60.5 63.25,59.75 57,59.75 | v56.25,39 56.25,34.5 58.5,32.25 66.5,32.25 67.5,31.25 67.5,29.4 SB2.2 66.35,28.15 67.5,27 67.5,23.25 v65,20.75
+1.2V-PRE
  Bottom 0.3: U5.5 64.65,28.11 SB2.1 64.65,29.05 C31.1
+2.5V  (via drill 0.35, 0.75)
  Top 0.3: U1.137 66,47.25 v65.75,47.5 | v55.5,68.5 U1.65 v55.5,65.5 | U1.30 v69.75,62.25 | U1.102 51.5,50.75 v51.75,50.5
  Power 0.3: v69.75,62.25 68.75,62.25 68.25,61.75 68.25,57.25 66.5,55.5 | v51.75,64.25 54.25,64.25 | 54.25,64.25 v55.5,65.5 | v55.25,39 55.25,46 54.25,47 54.25,48.5 | v65.75,47.5 66.5,48.25 66.5,55.5 | 54.25,64.25 54.25,61.75 56,60 56,55.5 | v69.75,55.5 66.5,55.5 | 66.5,55.5 56,55.5 | 54.25,48.5 56.5,50.75 56.5,52.75 56,53.25 56,55.5 | v51.75,50.5 52.25,50.5 54.25,48.5 | v60.75,29.25 60.75,27.75 57.5,24.5 54.25,24.5 48.75,19 45,19 41,15 v41,12.5
  Bottom 0.3: C13.1 64.75,47.75 65,47.5 v65.75,47.5 65,46.75 52,46.75 51,47.75 51,50.5 v51.75,50.5 51.9,50.35 C1.1 | C6.1 v55.5,65.5 | C20.1 69.25,61.75 v69.75,62.25 | R9.2 71.5,53.75 70.75,54.5 v69.75,55.5 | v55.25,39 55.75,38.5 55.75,34.25 58.25,31.75 59.62,31.75 59.88,31.5 59.88,30.12 v60.75,29.25 60.9,29.1 SB4.2 | R5.2 50.9,64.25 v51.75,64.25
+2.5V-PRE
  Bottom 0.3: U6.5 62.7,28.15 SB4.1 C34.1
+3.3V  (via drill 0.35, 0.75)
  Top 0.25: U2.8 51.51,71.74 52.85,70.4 C27.1 | U2.13 50.05,75.3 50.25,75.5 C22.1 | C22.1 C23.1 | C22.1 51.15,76.15 v51.5,76.5
  Top 0.3: D12.A v7.5,83.25 | U1.121 v58,47.5 | U1.138 66.5,47.25 v66.75,47.5 | U1.143 v69,47.5 | U1.13 v69.75,53.75 | U1.100 51.5,51.75 v51.75,51.5 | U1.79 51.5,62.25 v51.75,62.5 | U1.62 57,66 v56.5,65.5 | U1.64 56,66 v56.5,65.5 | U1.60 58,66 58.25,65.75 58.25,64.75 | v56.5,65.5 57.25,64.75 57.75,64.75 58.25,64.75 | U1.49 v63.5,65.5 | U1.42 v67,65.5 | U1.28 v69.75,61.25 | R2.2 78.65,75.35 | R3.2 78.65,75.35 | D15.A v90.5,10.5 | D4.A v46.25,77.25 | 78.65,75.35 78.65,76.1 v78.25,76.5 | C27.1 54.25,70.4 | 54.25,70.4 C26.1 | R4.2 35.6,86.65 v35.5,86.75 34.2,88.05 LED1.1 | D13.A 110.75,42.5 v110.5,42.5 | D3.A 41.65,85.25 J1.6 | 54.25,70.4 54.25,69.25 v54.75,68.75 | U1.57 59.5,65.5 58.75,64.75 58.25,64.75 | D5.A 114.5,81.5 114.5,76.25 110.38,72.13 KIT1.VOUT | D8.A 45,12.75 43.75,11.5 42.5,11.5 42,11 v42,10.25 | LED2.1 29.6,85.4 v31.25,83.75 | D14.A 34.69,5.31 v34.75,5.31 | D11.A 9.25,37.75 v9.5,37.5
  Bottom 0.25: IC1.9 23.77,88.78 v23.75,88.75 21.05,88.75 19.77,87.47 | R8.1 66.9,65.6 v67,65.5
  Bottom 0.3: X1.1 X1.4 58.15,73.94 C9.1 | X1.1 54.75,74.25 | 60.75,24.75 62.25,24.75 62.7,24.3 U6.1 U5.3 64.55,24.3 65,24.75 66,24.75 66.45,24.3 U5.1 | IC1.18 19.77,87.47 20,87.25 20,86 19.52,85.53 IC1.15 18.27,85.53 18,85.25 15.75,85.25 15.35,85.65 C21.1 | v66.75,47.5 67,47.75 C15.1 | v69,47.5 69.25,47.75 C16.1 | v69.75,53.75 69,54.5 C18.1 68.35,55.35 68.6,55.6 68.6,57.5 | v51.75,51.5 52.15,51.5 C2.1 | C8.1 57.75,47.75 v58,47.5 | C4.1 51.9,62.65 v51.75,62.5 | C7.1 57.65,64.35 v56.5,65.5 | C10.1 62.75,64.5 63.5,65.25 v63.5,65.5 | v67,65.5 67,64.1 C14.1 | v69.75,61.25 68.6,60.1 C19.1 68.6,57.5 | 68.6,57.5 67.85,58.25 v67.25,58.25 | X1.1 54.46,74.96 v55.5,76 | 60.75,24.75 60.5,24.75 59.75,25.5 v59.75,29.25 | R1.1 v42,10.25 | U6.3 60.8,24.7 60.75,24.75 | R10.2 v91,81.75
  pour Power (isolate 0.4, rank 2, no thermals): 27,0 0.25,26.75 0.25,95.5 121.25,95.5 121.25,26.75 94.5,0
+3.3V-LED  (via drill 0.35)
  Top 0.3: D1.A v45,11.25
  Bottom 0.3: v45,11.25 45,10.35 R1.2
+3V3  (via drill 0.35, 0.75)
  Top 0.3: DD:U1.45 23,68 22.75,67.75 v22.75,65.75 22.75,64.35 | 22.75,64.35 DD:C10.1 22.75,64.35 | DD:U1.19 32.9,75.5 DD:C1.1 33.65,77.4 v33.75,77.5 | DD:R1.1 37.25,72.25 v36,71 | M1:U1.19 M1:U1.20 32.5,54.5 32.75,54.75 M1:C1.1 33.65,55.65 v33.75,55.75 | M1:R1.1 37.35,50.6 v36.5,49.75 | M1:U1.45 23,46.5 22.75,46.25 22.75,44.25 22.75,44 | 22.75,44 22.75,42.9 M1:C10.1 | M2:U1.19 M2:U1.20 36.5,37.3 36.5,37.5 M2:C1.1 36.75,38.55 v36.75,39.25 | M2:U1.45 35.25,24.74 35.25,23.75 36.38,22.62 | M2:R1.1 43,37.7 v43,36.5 | M4:U1.45 98.5,59.5 99,60 v99,61.75 99,62.85 M4:C10.1 | M4:U1.19 M4:U1.20 89,51.5 88.75,51.25 M4:C1.1 87.6,51.1 v86.75,50.25 | M4:R1.1 84.15,56.35 v84,56.5 | M3:R1.1 81.85,41.85 v82.5,42.5 | M3:U1.45 94.76,34.25 95.5,34.25 96.75,35.5 | 97.6,36.35 M3:C10.1 | M3:U1.19 M3:U1.20 81.6,36.1 M3:C1.1 80.95,35.5 v80.75,35.5 | 96.75,35.55 M3:C10.1 | 96.75,35.55 96.75,35.5 | 96.75,35.5 96.75,35.55 | M3:C10.1 97.6,37.9 96.75,38.75 v95.5,38.75 | v36.75,23 36.38,22.62 | v22.25,44 22.75,44 | v38.25,19.75 38.25,20.8 M2:C10.1 37.1,21.9 36.38,22.62
  Power 0.7: v33.75,77.5 31.75,75.5 31.75,68.75 | 31.75,68.75 31.75,64.25 | v22.75,65.75 24.25,64.25 31.75,64.25 | v36,71 36,70 34.75,68.75 31.75,68.75 | 31.75,45.25 28.25,41.75 26.25,41.75 25.75,41.25 25.5,41 25.5,40.5 | 31.75,55.75 31.75,64.25 | 31.75,55.75 31.75,45.25 | v33.75,55.75 31.75,55.75 | 25.5,40.5 25.5,36.75 26.25,36 31.5,36 33.75,38.25 35.5,38.25 | 35.5,38.25 41.25,32.5 | v36.75,39.25 35.75,38.25 35.5,38.25 | v43,36.5 43.5,36 43.5,35 | 41.25,32.5 41.25,29.75 36.75,25.25 v36.75,23 | v36.5,49.75 36.5,48.5 35.25,47.25 33.75,47.25 31.75,45.25 | 94.25,49 92.75,50.5 89.25,50.5 | 94.25,49 96.5,46.75 96.5,42.5 95.25,41.25 | v99,61.75 96.25,59 96.25,51 94.25,49 | v84,56.5 84,55.75 89.25,50.5 | 43.5,35 50,35 52.5,32.5 56,32.5 58,32.5 | 88.75,41.25 95.25,41.25 | 58,32.5 66,32.5 80,32.5 81.88,34.38 | 84.25,36.75 81.88,34.38 | 84.25,36.75 88.75,41.25 | v58,29.25 58,32.5 | v80.75,35.5 81.88,34.38 | 88.75,41 88.75,41.25 | v82.5,42.5 82,42 82,39 84.25,36.75 | v95.5,38.75 95.5,41 95.25,41.25 | v22.25,44 25.5,40.75 25.5,40.5 | 41.25,32.5 41.25,32.75 43.5,35 | v86.75,50.25 87,50.5 89.25,50.5
  Bottom 0.3: SB1.2 57.15,28.4 v58,29.25 | R17.2 v42,8 35.75,8 32.75,11 32.75,14.5 36.12,17.88 | 36.12,17.88 36.25,18 | 36.12,17.88 38,19.75 v38.25,19.75
+3V3-PRE
  Bottom 0.3: U3.5 58.95,28.15 SB1.1 C30.1
+5V  (via drill 0.35, 0.75)
  Top 0.3: R12.1 65.1,86.9 v64.75,87.25
  Power 0.3: v64.75,87.25 64.75,89.75 65.75,90.75 107.84,90.75
  Power 0.7: 32,6.5 16.38,22.12 | 16.38,22.12 8.5,30 8.5,32.25 | 8.5,32.25 8.5,51.75 5.5,54.75 M1:J1.4 | M1:J2.4 8.5,32.25 | 113,38 113,38.25 M4:J2.4 | M4:J1.4 114.5,52.25 | 93.83,10.58 84.5,1.25 66.25,1.25 64,3.5 45,3.5 43.5,2 40.5,2 38.25,4.25 | 32,6.5 34.25,4.25 38.25,4.25 | 107.84,74.75 107.84,90.75 KIT1.VIN | 107.84,74.75 KIT1.VU | 107.84,74.75 111.25,74.75 112.25,73.75 112.25,68 114.5,65.75 114.5,52.25 | 38.25,4.25 39.75,5.75 | 39.75,5.75 v42,5.75 | 39.75,5.75 39.75,15 44.75,20 48.5,20 50.12,21.62 50.12,31.62 v48.75,33 | 114.5,52.25 114.5,42 113,40.5 113,38 | M2:J1.4 16.11,22.12 16.38,22.12 | M3:J2.4 93.91,10.58 93.83,10.58 | 103.66,20.41 93.83,10.58 | 103.66,20.41 113,29.75 113,38 | M3:J1.4 103.66,20.33 103.66,20.41 | M2:J2.4 31.99,6.5 32,6.5
  Bottom 0.3: R24.1 v42,5.75
  Bottom 0.7: 51.35,30.9 D9.C 51,30.75 v48.75,33
+5V-FUSE  (via drill 0.35)
  Top 0.3: v48.5,21.5 48.75,21.5 50,21.5 50.06,21.44 U7.7
  Top 0.9: C33.1 48.66,19.4 U7.7
  Bottom 0.3: R25.2 F1.1 | v48.5,21.5 50,21.5 50.75,22.25 R25.2 | C32.1 R25.2
+5V-PRE
  Bottom 0.3: D9.A 55.35,30.55 SB3.2 55.35,25.7 R16.2 56.15,25.6 56.75,25 58.5,25 58.95,24.55 U3.1
+5V-PRE2
  Bottom 0.3: F1.2 53,27.5 53.65,28.15 SB3.1
+18.5V  (via drill 0.35, 0.75)
  Top 0.3: M1:U1.25 23.5,56.5 v21.5,58.5 | DD:U1.25 23.25,78 v22,79.25 | M2:U1.25 28.12,31.75 v24.75,31.75 | R11.1 76.9,86.9 v77.25,87.25 | M3:U1.25 87.75,27.12 v87.75,23.25 | R6.1 64.75,38.25 | M4:U1.25 v98.5,48.5
  Power 0.3: v106.75,69.25 106.75,89 105.75,90 77.75,90 77.25,89.5 v77.25,87.25
  Bottom 0.3: R20.2 v42,3.5 39.5,3.5 32.25,10.75 32.25,15 | v106.75,69.25 109.12,66.88 109.12,66.38
  Bottom 1.5: 107.25,64.5 109.12,66.38 112.5,69.75 112.5,71.5 113.48,72.48 J3.1
  other vias: 58.75,37.75 66.25,37.75 66.25,34 58.75,34 26.75,38.25 26.75,39.25 27.75,37.25 27.75,38.25 28.75,40.25 28.75,37.25 27.75,39.25 28.75,39.25 26.75,37.25 28.75,38.25 27.75,40.25 26.75,40.25 58.75,36.5 58.75,35.25 60,37.75 61.25,37.75 62.5,37.75 63.75,37.75 65,37.75 66.25,36.5 66.25,35.25 60,34 61.25,34 62.5,34 63.75,34 65,34 60,35.25 60,36.5 61.25,36.5 61.25,35.25 62.5,35.25 62.5,36.5 63.75,36.5 63.75,35.25 65,35.25 65,36.5 94.75,45.75 94.75,44.75 92.75,43.75 93.75,44.75 92.75,44.75 93.75,45.75 92.75,45.75 92.75,42.75 93.75,43.75 94.75,42.75 93.75,42.75 94.75,43.75
  pour Bottom (no thermals): 13.5,61 18.25,61 18.25,41.25 13.5,41.25
  pour Bottom (no thermals): 13.5,80.5 18.25,80.5 18.25,61 13.5,61
  pour Bottom (no thermals): 18.75,26.5 22.25,30 34.75,17.5 31.25,14
  pour Bottom (no thermals): 108,47.25 103.25,47.25 103.25,65 108,65
  pour Bottom (no thermals): 93,17.75 89.5,21.25 102,33.75 105.5,30.25
  pour Top (no thermals): 73.25,33.5 58.25,33.5 58.25,38.25 73.25,38.25
  pour Power (no thermals): 66.75,33.5 66.75,38.25 55,38.25 47,46.25 34.25,46.25 28.5,40.75 26.5,40.75 26.5,37 31,37 35.5,41.25 45.25,41.25 53,33.5
  pour Bottom (no thermals): 102,33.75 102,34.5 96,40.5 92.25,40.5 94.5,43.25 97.75,43.25 105.25,35.75 105.25,30.5
  pour Bottom (no thermals): 103.25,47.25 102.25,46.25 92.25,46.25 92.25,44.75 94.25,43.25 104,43.25 108,47.25
  pour Power (no thermals): 70.75,33.5 66.75,33.5 66.75,38.25 67.5,38.25 78.75,49.5 90,49.5 93,46 95.25,46 95.25,42.5 90,42.5 88,44.5 81.75,44.5
  pour Bottom (no thermals): 13.5,79.75 21,79.75 22.75,78 22.75,75.25 26.75,75.25 26.75,79.75 24.25,82.25 13.5,82.25
  pour Bottom (no thermals): 92.25,46.25 92.25,40.5 95.25,40.5 95.25,46.25
  pour Bottom (no thermals): 18.75,26.5 22.25,30 22.25,31.25 26,34.75 27.25,36 29.25,37.25 23.75,37.25 18.75,32.25
  pour Bottom (no thermals): 13.5,41.25 16.5,38.25 29.25,38.25 29.25,41 19,41 18.25,42
  pour Bottom (no thermals): 29.25,35.75 29.25,38.25 29,40.25 23.75,40.25 23.75,35.75
  pour Bottom (no thermals): 26.75,58.25 18,58.25 18.25,62.25 26.75,62.25
  pour Bottom (no thermals): 28.5,32.5 26,35 23.25,32.25 25.75,29.75
  pour Bottom (no thermals): 35.5,25.75 31,21.25 32.5,19.75 37,24.25
  pour Bottom (no thermals): 93.75,18.5 89,23.25 89,24.5 85.75,27.75 84.5,26.5 84.5,25.25 92,17.75 93,17.75
  pour Bottom (no thermals): 96,32.25 100.25,36.5 97.5,39.25 93.25,35
  pour Bottom (no thermals): 95.75,51 95.75,46 99.5,46 99.5,51
  pour Bottom (no thermals): 26.75,48.5 26.75,40.75 22.75,40.75 22.75,48.5
  pour Bottom (no thermals): 99.5,62.5 101.5,64.5 107.5,64.5 105.75,66.75 100.25,66.75 97.75,64.25 95.75,64.25 95.75,62.5
BALL-DETECT  (via drill 0.35)
  Top 0.3: KIT1.P$15 78.75,89.5 78.75,88.25 81,86 91.5,86 95,82.5 v95.5,82.5
  Bottom 0.3: J6.1 95.69,82.31 v95.5,82.5 94.75,81.75 R10.1
BALL-EMIT
  Bottom 0.3: KIT1.P$25 72.93,70.57 74.25,69.25 90.75,69.25 91.25,69.75 91.25,76.35 R15.2
BALL-EMIT-PRE
  Bottom 0.3: J6.3 97.46,77.25 R15.1
BATT-FPGA
  Top 0.3: U1.136 65.5,42.75 64.75,42 R6.2 65.3,41.1 R7.1 C11.1
BOLT1  (via drill 3.8 pad 7.2)
  other vias: 3.75,90.44
BOLT2  (via drill 3.8 pad 7.2)
  other vias: 117.75,90.44
BOLT3  (via drill 3.8 pad 7.2)
  other vias: 109.25,34.44
BOLT4  (via drill 3.8 pad 7.2)
  other vias: 12.25,34.44
CPOUT
  Top 0.25: U2.20 44.87,73.28 C24.1
CS1
  Top 0.3: U4.10 68,21.1 R22.2
CS2
  Top 0.3: R23.2 72.65,20.1 72,20.75 U4.15
CS-DIS
  Top 0.3: 69.5,20 R21.2 69.6,20.2 U4.12
DD-!CS  (via drill 0.35)
  Top 0.3: DD:U1.4 33.75,68 35.5,66.25 38,66.25 41.75,62.5 v43,62.5 | RN2.11 44.4,61 v43.5,61
  Bottom 0.3: v43.5,61 43.5,62 v43,62.5
DD-A-H  (via drill 0.35)
  Top 0.3: DD:U1.13 30.5,72.5 v30.25,72.75 | RN2.9 43.95,62.55 43.5,63 43.5,63.5 38.75,68.25 38.75,69.5 v38.5,69.75
  Bottom 0.3: v30.25,72.75 31.75,72.75 32.5,72 33.25,72 34.25,73 37,73 37.75,72.25 37.75,70.5 v38.5,69.75
DD-A-L  (via drill 0.35)
  Top 0.3: DD:U1.14 32.5,73 v32.75,72.75 | v38.5,70.75 38.75,70.75 39.25,70.25 39.25,68.5 43.8,63.95 RN4.16
  Bottom 0.3: v32.75,72.75 33.25,72.75 34,73.5 37.25,73.5 38.5,72.25 v38.5,70.75
DD-B-H
  Top 0.3: DD:U1.15 37.75,73.5 39.75,71.5 39.75,68.75 43.75,64.75 RN4.15
DD-B-L
  Top 0.3: DD:U1.16 38,74 40.25,71.75 40.25,69 43.7,65.55 RN4.14
DD-C-H
  Top 0.3: DD:U1.17 38.25,74.5 40.75,72 40.75,69.25 43.65,66.35 RN4.13
DD-C-L
  Top 0.3: DD:U1.18 38.5,75 41.25,72.25 41.25,69.5 43.6,67.15 RN4.12
DD-H1
  Top 0.3: 36.5,79.25 36.5,79.5 | 36.5,79.25 36.5,79.5 | 36.5,79.5 36,80 21.25,80 20,81.25 6.75,81.25 4.75,79.25 DD:J1.3 | RN4.11 43.55,67.95 41.75,69.75 41.75,72.5 36.5,77.75 36.5,79.25
DD-H2
  Top 0.3: RN4.10 43.5,68.75 42.25,70 42.25,72.75 37,78 37,79.75 36.25,80.5 21.5,80.5 20.25,81.75 5.75,81.75 5.25,81.25 DD:J1.2
DD-H3
  Top 0.3: RN4.9 43.45,69.55 42.75,70.25 42.75,73 37.5,78.25 37.5,80 36.5,81 21.75,81 20.5,82.25 5.75,82.25 4.75,83.25 DD:J1.1
DD:AVDD
  Top 0.3: DD:U1.23 32.65,77.5 DD:C2.1
DD:BST-A
  Top 0.3: DD:U1.44 22.75,68.5 22.25,68 22.25,66.5 21.75,66 21.75,63 21,62.25 DD:C6.1
DD:BST-B
  Top 0.3: DD:C7.1 20.25,68.75 20.75,69.25 20.75,70 21.5,70.75 22.5,70.75 22.75,71 DD:U1.39
DD:BST-C
  Top 0.3: DD:U1.34 21.75,73.5 20,75.25 DD:C8.1
DD:CP1
  Top 0.3: DD:U1.10 32.5,71 33,70.5 33.65,70.5 DD:C3.1
DD:CP2
  Top 0.3: DD:U1.11 32.5,71.5 33,72 33.65,72 DD:C3.2
DD:EN-GATE  (via drill 0.35)
  Top 0.3: DD:R1.2 v34.75,72.25 | DD:U1.12 30.5,72 v30.25,71.75
  Bottom 0.3: v30.25,71.75 32,71.75 32.25,71.5 34,71.5 v34.75,72.25
DD:GH-A  (via drill 0.35)
  Top 0.3: v21.5,67.75 21.75,68 21.75,68.25 22.5,69 DD:U1.43
  Power 0.3: v21.5,67.75 21,68.25 v11.5,68.25
  Bottom 0.3: DD:Q1.4 11.48,68.23 v11.5,68.25
DD:GH-B  (via drill 0.35)
  Top 0.3: DD:U1.38 22,71.5 v21.75,71.5
  Power 0.3: v21.75,71.5 21.75,72.75 19.75,74.75 v11.5,74.75
  Bottom 0.3: DD:Q3.4 11.48,74.73 v11.5,74.75
DD:GH-C  (via drill 0.35)
  Top 0.3: v22,74.25 22.25,74 DD:U1.33
  Power 0.3: v22,74.25 21.75,74.5 21.75,78.5 19.25,81 10.75,81 v10,80.25
  Bottom 0.3: 10.16,80.41 v10,80.25 10.16,80.41 | DD:Q5.4 10.16,80.41
DD:GL-A
  Top 0.3: DD:Q2.4 19.66,67.41 20.16,67.41 21.25,68.5 21.25,69.75 21.75,70.25 22.5,70.25 22.75,70 DD:U1.41
DD:GL-B
  Top 0.3: DD:U1.36 22.5,72.5 22,73 21,73 20.09,73.91 DD:Q4.4
DD:GL-C
  Top 0.3: 23,75 DD:U1.31 23,75 | DD:Q6.4 20.09,80.41 21.25,79.25 21.25,76.75 23,75
DD:GVDD  (via drill 0.35)
  Top 0.3: DD:U1.9 30.5,70.5 v30.25,70.75 | v34.75,70.75 34.9,70.75 DD:C9.1
  Bottom 0.3: v30.25,70.75 v34.75,70.75
DD:PHASE-A  (via drill 0.35)
  Top 0.3: DD:U1.42 v22,69.5 | 13.18,64.25 13.18,64.75 | 13.18,64.25 13.18,63.68 | 13.18,64.75 DD:Q2.5678 | DD:C6.2 16.75,62.25 15.25,63.75 14.18,63.75 13.18,64.75 | v12.25,62.75 12.25,63.32 13.18,64.25
  Power 0.3: v22,69.5 22.5,69 22.75,68.75 22.75,67.75 21.75,66.75 21.75,63.75 20.75,62.75 v12.25,62.75
  other vias: 10.25,66 9.5,65.5 10.25,65 9.5,64.5 10.25,64
  pour Top (no thermals): 3,68.75 3,69.75 6.5,69.75 10,66.25 12.25,66.25 12.25,63.5 9.25,63.5 9.25,65.25 5.75,68.75
  pour Bottom (no thermals): 12.25,63.5 12.25,66.25 9.25,66.25 9.25,63.5
DD:PHASE-B  (via drill 0.35)
  Top 0.3: 13.18,70.75 DD:Q4.5678 14.93,70.25 15.25,70.25 16.75,68.75 DD:C7.2 | 13.18,70.75 13.18,70.18 | DD:U1.37 22.25,72 22,72.25 v21,72.25 | v12.25,69.25 12.25,69.82 13.18,70.75
  Power 0.3: v12.25,69.25 20.25,69.25 21,70 v21,72.25
  other vias: 10.25,72.5 9.5,72 10.25,71.5 9.5,71 10.25,70.5
  pour Top (no thermals): 9,70 8.25,70.75 3,70.75 3,71.75 8.25,71.75 9.25,72.75 12.25,72.75 12.25,70
  pour Bottom (no thermals): 12.25,70 12.25,72.75 9.25,72.75 9.25,70
DD:PHASE-C  (via drill 0.35)
  Top 0.3: 13.25,78.5 DD:Q6.5678 | 13.5,78.5 DD:Q6.5678 | DD:C8.2 16.75,75.25 15.5,76.5 13.93,76.5 13.18,77.25 | 13.18,77.25 DD:Q6.5678 | 13.18,77.25 13.18,76.68 | v21,75.75 21.5,75.75 22.75,74.5 DD:U1.32 | v12.25,75.75 12.25,76.32 13.18,77.25
  Power 0.3: v12.25,75.75 13,75.75 v21,75.75
  other vias: 10.25,79 9.5,78.5 10.25,78 9.5,77.5 10.25,77
  pour Top (no thermals): 10.25,76.5 12.25,76.5 12.25,79.25 9.25,79.25 9.25,77.25 5.75,73.75 3,73.75 3,72.75 6.5,72.75
  pour Bottom (no thermals): 12.25,76.5 12.25,79.25 9.25,79.25 9.25,76.5
DIP-1  (via drill 0.35)
  Top 0.3: S2.1 26.04,92.29 v24,90.25
  Bottom 0.3: IC1.22 23.08,90.08 23.25,90.25 v24,90.25
DIP-2  (via drill 0.35)
  Top 0.3: S2.2 v23.5,91
  Bottom 0.3: IC1.23 22.73,90.72 23,91 v23.5,91
DIP-3  (via drill 0.35)
  Top 0.3: S2.3 20.96,92.54 v22,91.5
  Bottom 0.3: IC1.24 21.12,91.38 21.25,91.5 v22,91.5
EN-PWR  (via drill 0.35)
  Top 0.3: 67.25,24 72.5,24 72.8,23.7 U4.16 | 67.25,24 66.5,24 66,23.5 66,20 65.5,19.5 56.75,19.5 56,18.75 55.25,18.75 | 55.25,18.75 v54,18.75 | U7.3 48.98,26.52 48.75,26.75 v48.25,26.75 | S3.2 55.25,18.75 | U4.9 67.2,23.95 67.25,24
  Power 0.3: v47.5,21.5 47.5,26 v48.25,26.75
  Bottom 0.3: v47.5,21.5 47.5,20.25 49,18.75 v54,18.75
EN-PWR-PRE  (via drill 0.35)
  Top 0.3: S3.1 59,12 v59,14.25
  Bottom 0.3: R18.1 R19.2 68.25,22.25 65.5,19.5 58.5,19.5 57.75,18.75 57.75,15.5 v59,14.25
FB  (via drill 0.35)
  Top 0.3: U7.6 48.6,22.71 v48.5,22.81
  Bottom 0.3: R25.1 C32.2 47.5,25.6 | 47.5,25.6 R26.2 | 47.5,25.6 47.5,23.25 47.94,22.81 v48.5,22.81
FPGA-CLK  (via drill 0.35)
  Top 0.3: U1.50 v63,68.5
  Bottom 0.3: v63,68.5 61.54,68.5 59.79,70.25 X1.3
FPGA-DONE  (via drill 0.35)
  Top 0.3: U1.72 51.35,67.1 v51.25,67 | v46.25,80.75 55.5,80.75 56.75,82 v58.25,82
  Bottom 0.3: R5.1 51.1,66.85 v51.25,67 51.25,72.75 48.5,75.5 48.5,78 46.25,80.25 v46.25,80.75 | v58.25,82 59,82 63.75,82 64.25,82.5 79.5,82.5 81,81 81,73 82,72 83.55,72 KIT1.P$30 84.93,70.57
FPGA-INIT  (via drill 0.35)
  Top 0.3: KIT1.P$19 64.66,88.16 64,87.5 64,87 65.75,85.25 65.75,70.25 67.5,68.5 v68,68.5 U1.40
  Bottom 0.3: R8.2 68.6,67.9 v68,68.5
FPGA-PROG  (via drill 0.35)
  Top 0.3: U1.1 71.35,47.15 v71.75,46.75 | v63,86.25 63.5,85.75 63.75,85.5 63.75,82.25 63.5,82 v63.5,78
  Bottom 0.3: R9.1 71.5,47 v71.75,46.75 72.75,47.75 72.75,67.75 71.25,69.25 64.25,69.25 63.5,70 v63.5,78 | KIT1.P$11 84.98,86.73 84.25,86 63.25,86 v63,86.25
GND  (via drill 0.35, 1.02)
  Top 0.25: U2.9 51.74,72.24 51.88,72.1 C27.2 | C22.2 C23.2 46.5,76.35 v46.5,75 | U2.18 46.91,74.59 v46.5,75 | C24.2 46.4,75.1 v46.5,75 | C26.2 55.15,72.1 | U2.11 51.53,73.28 51.75,73.5 51.75,74.25 v51.5,74.5 | U2.1 47.49,69.76 47.75,69.5 v48.25,69.5
  Top 0.3: 26,46 M1:U1.46 M1:U1.47 M1:U1.48 24,44.5 24.6,43.9 M1:C10.2 | M1:U1.30 26,54 | M1:U1.35 26,51.5 | M1:U1.40 26,49 | M1:U1.24 30,56.5 29.5,56 | M1:U1.8 29.5,48.5 | M1:U1.3 29.5,46 | R21.1 v69.5,17.25 | R22.1 v67,17.25 | R23.1 v73.5,17.25 | C36.2 v45,25 | C35.2 v45.75,26.75 | M2:U1.48 M2:U1.47 M2:U1.46 37.97,26.75 38,26.75 | DD:U1.48 DD:U1.47 DD:U1.46 26,67.5 | U1.118 v56.5,47.5 | U1.127 v61,47.5 | U1.133 v64,47.5 | U1.11 v69.75,52.75 | U1.19 v69.75,56.75 | U1.37 v69.5,65.5 | U1.55 v60.5,65.5 | U1.61 v57.5,65.5 | U1.73 v51.75,65.25 | U1.90 v51.75,56.75 | 35.35,55.65 M1:C1.2 | 35.35,55.65 v35.25,55.75 | M1:C2.2 35.35,55.65 | M1:C9.2 37.35,49.6 v37.5,49.75 | DD:U1.3 29.5,67.5 | DD:U1.8 29.5,70 | DD:U1.20 29.5,76 | DD:U1.24 30,78 29.5,77.5 | DD:U1.30 26,75.5 | DD:U1.35 26,73 | DD:U1.40 26,70.5 | M2:U1.30 32.15,32.25 32.25,32.25 | M2:U1.35 33.94,30.5 34,30.5 | M2:U1.40 35.73,28.75 35.75,28.75 | M2:U1.3 40.22,29 40,29 | M2:U1.8 38.5,30.82 38.5,30.75 | M2:U1.24 33.5,37.13 33.5,36 | M2:C10.2 v39.25,24 | M2:C9.2 43.75,36.95 v43.75,37.25 | M2:C1.2 37.7,40 v37.5,40 37.5,40.2 M2:C2.2 | S2.6 S2.5 | S2.5 S2.4 | M4:C9.2 84.15,57.35 v85,56.5 | M4:U1.8 92,57.5 | 92,60 M4:U1.3 | 95.5,60 M4:U1.46 M4:U1.47 M4:U1.48 v97.5,61.75 97.15,62.1 M4:C10.2 | M4:U1.40 95.5,57 | M4:U1.35 95.5,54.5 | M4:U1.30 95.5,52 | M4:U1.24 91.25,49.5 92,50.25 | M3:U1.3 90.47,39.25 90.5,39.25 | M3:U1.8 88.68,37.5 88.75,37.5 | 92.5,37 92.72,37 M3:U1.46 M3:U1.47 M3:U1.48 M3:C10.2 94.9,37.6 v94.75,37.75 | M3:U1.40 90.75,34.73 90.75,34.75 | M3:U1.35 89,32.94 89,33 | M3:U1.30 87.25,31.15 87.25,31.25 | M3:U1.24 82.37,32.5 83.5,32.5 | U1.99 51.5,52.25 v51.75,52.5 | U1.46 65,65.75 v64.75,65.5 | U1.27 70.25,60.75 70,60.5 v69.75,60.25
  Top 0.3: M3:C9.2 83.15,41.85 v83.25,41.75 | M3:C2.2 79.55,36.5 v79.75,36.5 79.75,36.7 M3:C1.2 | DD:C10.2 24.35,65.6 v24.5,65.75 | M4:C2.2 85.9,50.1 v85.75,50.25 85.9,50.4 M4:C1.2 | R14.2 70.1,87.35 v71,88.25 | C28.2 71.9,87.35 v71,88.25 | C29.2 70.1,89.15 v71,88.25 | R13.2 71.9,89.15 v71,88.25 | 35.35,77.4 DD:C1.2 | 35.35,77.4 v35.25,77.5 | DD:C2.2 35.35,77.4 | DD:C9.2 37.35,70.65 v37,71 | S2.5 v23.5,86.5 | 54.25,72.1 55.15,72.1 | 54.25,72.1 C27.2 | 54.25,72.1 54.35,72.2 C25.2 54.35,75.9 v54.25,76 | D7.C v43.5,4.5 D10.C v43.5,6.75 D6.C D1.C | LED2.3 33.15,82.1 v32.75,82.5 | LED1.3 31.9,92.4 v33.25,93.75 | C11.2 R7.2 67.1,41.1 v68,42 | 24.6,43.75 v27.5,43.75 | U4.13 70.4,21.35 v70.75,21
  Top 0.9: U7.4 53.5,25.25 | C33.2 49.85,16.6 50.25,17 J7.2
  Bottom 0.3: v70.75,21 71.75,21 72.35,21.6 R19.1 | R26.1 v46.25,22.75 | U6.2 61.75,22.25 v62,22 | IC1.17 IC1.16 18.17,86.17 17.75,85.75 16.1,85.75 C21.2 13.35,87.35 v13.25,87.25 | C1.2 52.35,48.65 v52,49 | C2.2 v55.75,52.25 55.75,51.5 55.5,51.25 C5.2 | C8.2 v57.75,51.5 | C6.2 v55.5,61.5 54.75,60.75 C3.2 | C7.2 v57.75,61.5 | C10.2 v62.75,61.25 | C12.2 v65,61.25 65.75,61.25 66.25,61.75 C20.2 | C19.2 v65.5,59.5 | C14.2 v69.75,64 | C18.2 v65.25,54.5 | C17.2 v65.25,52.25 64.75,51.75 C13.2 | C15.2 67.85,50.35 v68,50.5 68.15,50.35 C16.2 | C4.2 52.65,64.35 v51.75,65.25 | U3.2 v58,22 | C9.2 59.85,74.56 59.67,74.38 | 59.67,74.38 X1.2 | J6.2 95.52,79.77 v95.5,79.75 | C30.2 57.15,29.65 v57,29.5 | 60.9,30.35 C34.2 60.9,30.35 | 60.9,30.35 v61.75,29.5 | C31.2 63.75,29.85 v63.75,29.5 | U5.2 65.5,23 v65,22.5 | IC1.10 25.12,88.12 v23.5,86.5 | v61.5,74.25 59.81,74.25 59.67,74.38 | J4.6 v113.5,79
  other vias: 19,44 19.75,44.5 19.75,43.5 19.75,42.5 19,43 19,50.5 19.75,51 19.75,50 19.75,49 19,49.5 19,57 19.75,57.5 19.75,56.5 19.75,55.5 19,56 27.75,51.75 28.25,51 27.25,51 27.75,50.25 28.75,50.25 26.75,51.75 28.75,51.75 26.75,50.25 50.5,5.25 50.5,6.25 50.5,7.25 50.5,8.25 50.5,9.25 50.5,10.25 54,22 55,22 56,22 57,22 59,22 60,22 61,22 62,21 61,21 60,21 59,21 58,21 57,21 56,21 55,21 54,21 19,65.5 19.75,66 19.75,65 19.75,64 19,64.5 19,72 19.75,72.5 19.75,71.5 19.75,70.5 19,71 19,78.5 19.75,79 19.75,78 19.75,77 19,77.5 27.75,73.25 28.25,72.5 27.25,72.5 27.75,71.75 28.75,71.75 26.75,73.25 28.75,73.25 26.75,71.75 102.5,62.25 101.75,61.75 101.75,62.75 101.75,63.75 102.5,63.25 102.5,55.75 101.75,55.25 101.75,56.25 101.75,57.25 102.5,56.75 102.5,49.25 101.75,48.75 101.75,49.75 101.75,50.75 102.5,50.25 93.75,54.5 93.25,55.25 94.25,55.25 93.75,56 92.75,56 94.75,54.5 92.75,54.5 94.75,56 34.75,30.75 35.5,31.5 36.25,32.25 36.5,31.25 35.75,30.5 36,29.5 36.75,30.25 37.5,31 24.5,29.75 24.5,29 25.25,29 25.25,28.25 26,28.25 29.25,25 29.25,24.25 30,24.25 30,23.5 30.75,23.5 34,20.25 34,19.5 34.75,19.5 34.75,18.75 35.5,18.75 88.75,33.75 88,34.5 87.25,35.25 88.25,35.5 89,34.75 90,35 89.25,35.75 88.5,36.5 89.75,23.5 90.5,23.5 90.5,24.25 91.25,24.25 91.25,25 94.5,28.25 95.25,28.25 95.25,29 96,29 96,29.75 99.25,33 100,33 100,33.75 100.75,33.75 100.75,34.5 28.25,61 27.75,61.75 28.75,61.75 29.75,61.75 28.75,60.25 29.75,60.25 27.75,60.25 29.25,61 35.75,2.75
  pour Top (no thermals): 16.75,44.75 20.25,44.75 20.25,42 16.75,42
  pour Top (no thermals): 16.75,51.25 20.25,51.25 20.25,48.5 16.75,48.5
  pour Top (no thermals): 16.75,57.75 20.25,57.75 20.25,55 16.75,55
  pour GND (isolate 0.4, no thermals): 27,0 0.25,26.75 0.25,95.5 121.25,95.5 121.25,26.75 94.5,0
  pour Top (no thermals): 26,56 26,45.75 29.5,45.75 29.5,56
  pour Top (no thermals): 58,3.25 49.75,3.25 49.75,13 53.5,13 53.5,5.5 58,5.5
  pour Top (no thermals): 62.75,20.25 53.25,20.25 53.25,28 62.75,28
  pour Top (no thermals): 26,77.5 26,67.25 29.5,67.25 29.5,77.5
  pour Top (no thermals): 16.75,79.25 20.25,79.25 20.25,76.5 16.75,76.5
  pour Top (no thermals): 16.75,72.75 20.25,72.75 20.25,70 16.75,70
  pour Top (no thermals): 16.75,66.25 20.25,66.25 20.25,63.5 16.75,63.5
  pour Top (no thermals): 24.25,25.75 22,28 24.5,30.5 26.75,28.25
  pour Top (no thermals): 29,21 26.75,23.25 29.25,25.75 31.5,23.5
  pour Top (no thermals): 33.75,16.25 31.5,18.5 34,21 36.25,18.75
  pour Top (no thermals): 31,33.5 33.5,36 40.5,29 38,26.5
  pour Top (no thermals): 95.5,50.25 95.5,60.5 92,60.5 92,50.25
  pour Top (no thermals): 104.75,61.5 101.25,61.5 101.25,64.25 104.75,64.25
  pour Top (no thermals): 104.75,55 101.25,55 101.25,57.75 104.75,57.75
  pour Top (no thermals): 104.75,48.5 101.25,48.5 101.25,51.25 104.75,51.25
  pour Top (no thermals): 93.75,23.25 91.5,21 89,23.5 91.25,25.75
  pour Top (no thermals): 98.5,28 96.25,25.75 93.75,28.25 96,30.5
  pour Top (no thermals): 103.25,32.75 101,30.5 98.5,33 100.75,35.25
  pour Top (no thermals): 86,30 83.5,32.5 90.5,39.5 93,37
  pour Bottom (no thermals): 83.5,32.25 88.5,37.25 88.5,39.75 87.5,40.75 88.5,41.75 91.25,39 91.25,35.5 85.25,29.5 81.75,29.5 79,32.25 80,33.25 81,32.25
  pour Bottom (no thermals): 30.5,34.25 37.25,27.5 39.5,27.5 42.25,30.25 41,31.5 40.25,30.75 38.5,30.75 33.75,35.5 33.75,37.25 34.5,38 33.25,39.25 30.5,36.5
  pour Bottom (no thermals): 92.25,59.5 89.25,62.5 87.5,62.5 87.5,64 91.25,64 95.25,60 95.25,52.25 92.5,49.5 87.5,49.5 87.5,51 89.5,51 92.25,53.75
  pour Top (no thermals): 32,0 36.5,0 36.5,3.75 32,3.75
  pour Bottom (no thermals): 29.25,71.25 29.25,73.25 30.75,74.75 34.75,74.75 34.75,76.75 29.5,76.75 26.25,73.5 26.25,71.25
  pour Bottom (no thermals): 27.5,58.25 27.5,62.25 34.75,62.25 34.75,58.25
  pour Bottom (no thermals): 26.5,52 26.5,50 27.5,49 27.5,48 28.5,47 34.75,47 34.75,48.5 29.75,48.5 29.25,49 29.25,52
GPB0
  Bottom 0.3: IC1.1 26.73,93.97 27.3,94.55 RN9.8
GPB1
  Bottom 0.3: IC1.2 26.92,93.33 27.35,93.75 RN9.7
GPB2
  Bottom 0.3: IC1.3 27.02,92.67 27.3,92.95 RN9.6
GPB3
  Bottom 0.3: IC1.4 27.12,92.03 27.25,92.15 RN9.5
GPB4
  Bottom 0.3: IC1.5 27.12,91.38 27.15,91.35 RN9.4
GPB5
  Bottom 0.3: IC1.6 27.02,90.72 27.2,90.55 RN9.3
GPB6
  Bottom 0.3: IC1.7 26.92,90.08 27.25,89.75 RN9.2
GPB7
  Bottom 0.3: IC1.8 26.83,89.42 27.3,88.95 RN9.1
HEX-0
  Bottom 0.3: IC1.28 15.48,93.97 13.29,91.79 S1.1
HEX-1
  Bottom 0.3: S1.2 16.83,87.58 17.75,88.5 17.75,91.75 18.02,92.03 IC1.25
HEX-2
  Bottom 0.3: IC1.27 15.83,93.33 S1.4
HEX-3
  Bottom 0.3: IC1.26 17.72,92.67 S1.8
INT-IO  (via drill 0.35)
  Top 0.3: v62,85.25 61.25,86 59.25,86 57.75,87.5 46,87.5 45.25,86.75 45.25,82.25 44.5,81.5 38.25,81.5 35.25,84.5 33.25,84.5 31.5,86.25 31.5,89 30.25,90.25 28.25,90.25 27.5,89.5 v25,89.5
  Bottom 0.3: v62,85.25 62.25,85 93.5,85 93.75,85.25 93.75,85.75 94,86 94,91.25 93.25,92 91.49,92 KIT1.P$9 | IC1.20 20.02,88.78 20.75,89.5 v25,89.5
INT-MPU  (via drill 0.35)
  Top 0.25: U2.12 50.87,74.87 53,77 55.25,77 56,77.75 56,80.5 56.92,81.42 60.92,81.42 61.25,81.75 v61.25,84.75
  Bottom 0.3: v61.25,84.75 61.5,84.5 93.75,84.5 94.25,85 94.25,85.5 94.5,85.75 94.5,91.5 92.6,93.4 KIT1.P$8
INT-RADIO
  Bottom 0.3: J1.3 50.23,86.75 61.5,86.75 62.75,85.5 84.5,85.5 85.5,86.5 85.5,91.41 KIT1.P$10
LED-BALL  (via drill 0.35)
  Top 0.25: 65.25,72.75 v65,72.5
  Top 0.3: 65.25,72.75 65.25,85 63.25,87 59.75,87 58.25,88.5 39.75,88.5 D2.C
  Bottom 0.25: v65,72.5 67.81,72.5 KIT1.P$24
LED-BALL-PRE
  Top 0.3: R4.1 D2.A
LED-DD  (via drill 0.35)
  Top 0.3: D12.C v7.5,84.75
  Bottom 0.3: RN9.16 30.55,88.95 30.75,88.75 30.75,87.5 28,84.75 v7.5,84.75
LED-KICK  (via drill 0.35)
  Top 0.3: v83.5,87.75 83.75,87.5 92.25,87.5 93.25,86.5 97,86.5 97.5,86 105.75,86 107.25,84.5 D5.C
  Bottom 0.3: RN9.9 31.2,94.55 38,87.75 63.75,87.75 64,88 65.25,88 66.25,87 75.75,87 76.75,88 77.5,88 78.5,87 82.75,87 v83.5,87.75
LED-M1  (via drill 0.35)
  Top 0.3: D11.C v6.25,40
  Bottom 0.3: v6.25,40 6.25,41.25 7,42 7,81.25 10,84.25 28.25,84.25 31.25,87.25 31.25,89.25 30.75,89.75 RN9.15
LED-M2  (via drill 0.35)
  Top 0.3: D14.C v32.25,7.75
  Bottom 0.3: v32.25,7.75 32,8 29,8 7.5,29.5 7,30 7,41.25 7.5,41.75 7.5,81 10.25,83.75 28.5,83.75 31.75,87 31.75,89.75 30.95,90.55 RN9.14
LED-M3  (via drill 0.35)
  Top 0.3: D15.C v88,8
  Bottom 0.3: RN9.12 31.35,92.15 32.75,90.75 32.75,86.5 29,82.75 10.75,82.75 8.5,80.5 8.5,41.25 8,40.75 8,30.5 8.5,30 29.5,9 33.25,9 40,2.25 46.25,2.25 48,4 64,4 66.5,1.5 85.25,1.5 88,4.25 v88,8
LED-M4  (via drill 0.35)
  Top 0.3: D13.C 111.25,40 v112,39.25
  Bottom 0.3: RN9.13 31.15,91.35 32.25,90.25 32.25,86.75 28.75,83.25 10.5,83.25 8,80.75 8,41.5 7.5,41 7.5,30.25 8,29.75 29.25,8.5 33,8.5 39.75,1.75 46.5,1.75 48.25,3.5 63.75,3.5 66.25,1 85.5,1 88.75,4.25 88.75,5.75 113.25,30.25 113.25,38 v112,39.25
LED-MPU  (via drill 0.35)
  Top 0.3: D4.C v43.75,78.25
  Bottom 0.3: RN9.11 31.3,92.95 38.75,85.5 38.75,81.75 42.25,78.25 v43.75,78.25
LED-NEO  (via drill 0.35)
  Top 0.3: v46.5,78.25 47.25,79 53,79 53.5,79 54.5,78 v55,78 | v42.25,82.25 38.25,82.25 35.1,85.4 LED2.4
  Bottom 0.3: v55,78 57.5,78 59.5,80 64.75,80 65.25,80.5 78.5,80.5 79,80 79,73 78,72 76.25,72 KIT1.P$26 | v46.5,78.25 45.25,78.25 43.75,79.75 43.75,80.75 v42.25,82.25
LED-RADIO  (via drill 0.35)
  Top 0.3: v39.5,84.25 D3.C
  Bottom 0.3: RN9.10 31.25,93.75 39.5,85.5 v39.5,84.25
M1-!CS
  Top 0.3: M1:U1.4 33.75,46.5 34.25,46 38.75,46 40.75,48 40.75,51.25 42.1,52.6 RN3.13
M1-A-H
  Top 0.3: RN3.9 43.05,55.8 40.25,53 37.75,53 36.75,52 M1:U1.15
M1-A-L
  Top 0.3: RN2.16 43.45,56.95 40,53.5 37.5,53.5 36.5,52.5 M1:U1.16
M1-B-H  (via drill 0.35)
  Top 0.3: v30.25,51.25 30.5,51 M1:U1.13 | RN3.11 42.95,54.2 40.25,51.5 v38.5,51.5
  Bottom 0.3: v30.25,51.25 31,50.5 33,50.5 34,51.5 v38.5,51.5
M1-B-L  (via drill 0.35)
  Top 0.3: v32.75,51.25 32.5,51.5 M1:U1.14 | RN3.10 43,55 40.25,52.25 v38,52.25
  Bottom 0.3: v32.75,51.25 33.75,52.25 v38,52.25
M1-C-H
  Top 0.3: M1:U1.17 36.25,53 37.25,54 39.75,54 42.75,57 42.75,58 43.3,58.55 RN2.14
M1-C-L
  Top 0.3: M1:U1.18 36,53.5 37,54.5 39.5,54.5 42.25,57.25 42.25,58.25 43.35,59.35 RN2.13